# Altium project CM5_RP2040_MZM.PrjPcb (part 3 of 3)

## Sheet Bias_Q.SchDoc: 11 - Canal de BIAS Q
size A3; Project: CM5 Photonic Bias Controller; DocumentRev: R5; ProjectRev: R5; Version: Rev R6; SheetNumber: 12; SheetTotal: 17; Author: Carlos Renan; SCH_SCALE: N/A; Address1: UFCG; Address2: Referencia: VIRTUS CC; Address3: Campina Grande - PB; ProjectName: Controle automatico de BIAS para MZM/IQ - Projeto 3; DocumentName: Bias_Q.SchDoc
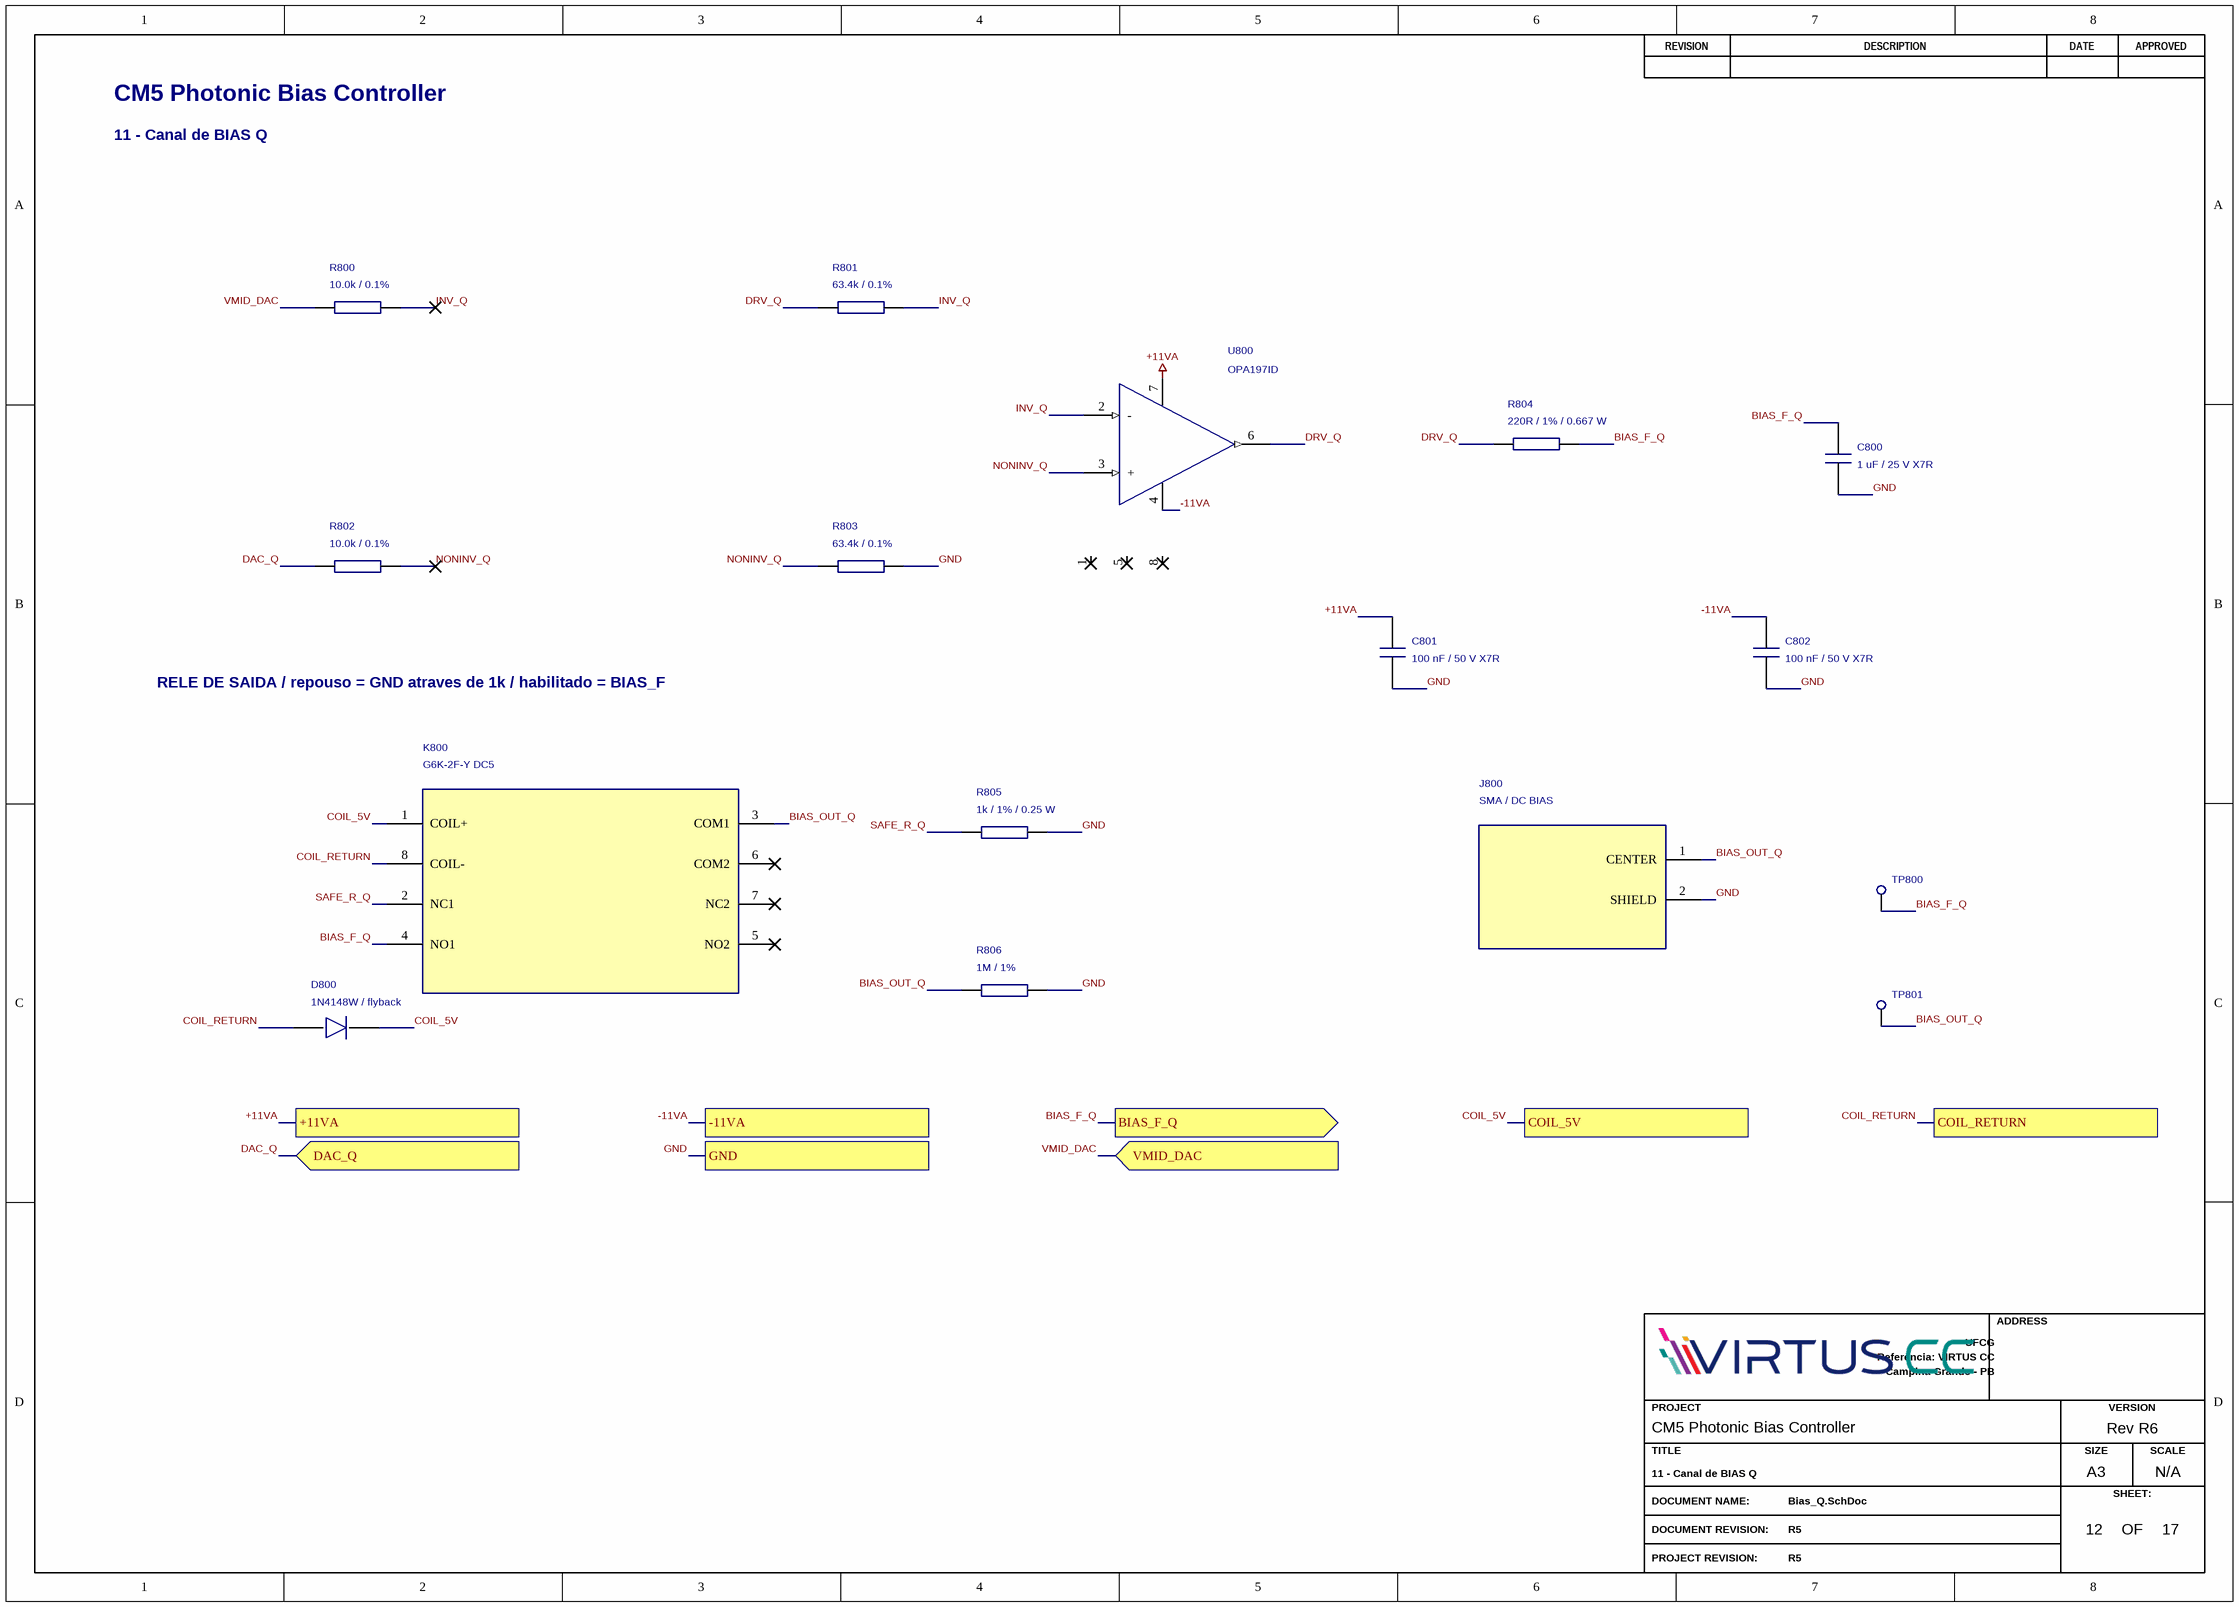
[diagram p14: Bias_Q.SchDoc]

### Parts
C800  1 uF / 25 V X7R  [C0805]
C801  100 nF / 50 V X7R  [C0805]
C802  100 nF / 50 V X7R  [C0805]
D800  1N4148W / flyback  [SOD-123]
J800  SMA / DC BIAS  [SMA_132134]
K800  G6K-2F-Y DC5  [G6K_2F_Y]
R800  10.0k / 0.1%  [R-0603]
R801  63.4k / 0.1%  [R-0603]
R802  10.0k / 0.1%  [R-0603]
R803  63.4k / 0.1%  [R-0603]
R804  220R / 1% / 0.667 W  [R1206]
R805  1k / 1% / 0.25 W  [R1206]
R806  1M / 1%  [R-0603]
TP800  Testpoint  [TP06R]  (value not drawn)
TP801  Testpoint  [TP06R]  (value not drawn)
U800  OPA197ID  [SOIC8]

### Ports
+11VA, -11VA, BIAS_F_Q (out), COIL_5V, COIL_RETURN, DAC_Q (in), GND, VMID_DAC (in)

### Nets
+11VA: C801.1 U800.7(V+) ; port +11VA
GND: C800.2 C801.2 C802.2 J800.2(SHIELD) R803.2 R805.2 R806.2 ; port GND
-11VA: C802.1 U800.4(V-) ; port -11VA
BIAS_F_Q: C800.1 K800.4(NO1) R804.2 TP800.1(TP) ; port BIAS_F_Q
BIAS_OUT_Q: J800.1(CENTER) K800.3(COM1) R806.1 TP801.1(TP)
COIL_5V: D800.1(K) K800.1(COIL+) ; port COIL_5V
COIL_RETURN: D800.2(A) K800.8(COIL-) ; port COIL_RETURN
DAC_Q: R802.1 ; port DAC_Q
DRV_Q: R801.1 R804.1 U800.6(OUT)
INV_Q: R800.2 R801.2 U800.2(-)
NONINV_Q: R802.2 R803.1 U800.3(+)
SAFE_R_Q: K800.2(NC1) R805.1
VMID_DAC: R800.1 ; port VMID_DAC

Not connected (* = marked no-connect by the designer): K800 5(NO2)* 6(COM2)* 7(NC2)*; U800 1(NC)* 5(NC)* 8(NC)*

### Notes on the sheet
- CM5 Photonic Bias Controller
- 11 - Canal de BIAS Q
- RELE DE SAIDA / repouso = GND atraves de 1k / habilitado = BIAS_F
- REVISION
- DESCRIPTION
- DATE
- APPROVED
- ADDRESS
- PROJECT
- VERSION
- TITLE
- A3
- SIZE
- SCALE
- DOCUMENT NAME:
- DOCUMENT REVISION:
- OF
- SHEET:
- PROJECT REVISION:

### Library data of the parts
C800 = 1 uF: Manufacturer: KEMET; Manufacturer Part Number: C0805C105K3RACTU; Procurement Status: Busca por MPN; SKU e disponibilidade a confirmar; BOM Purchase: Yes; Manufacturer 1: KEMET; Manufacturer Part Number 1: C0805C105K3RACTU; Supplier 1: DigiKey; Supplier URL 1: https://www.digikey.com.br/pt/products/result?keywords=C0805C105K3RACTU; Supplier 2: Mouser; Supplier URL 2: https://br.mouser.com/c/?q=C0805C105K3RACTU; Datasheet: https://www.yageogroup.com/download/specsheet/C0805C105K3RACTU
C801 C802 = 100 nF: Manufacturer: KEMET; Manufacturer Part Number: C0805C104K5RACTU; Procurement Status: Busca por MPN; SKU e disponibilidade a confirmar; BOM Purchase: Yes; Manufacturer 1: KEMET; Manufacturer Part Number 1: C0805C104K5RACTU; Supplier 1: DigiKey; Supplier URL 1: https://www.digikey.com.br/pt/products/result?keywords=C0805C104K5RACTU; Supplier 2: Mouser; Supplier URL 2: https://br.mouser.com/c/?q=C0805C104K5RACTU; Datasheet: https://www.yageogroup.com/download/specsheet/C0805C104K5RACTU
D800 = 1N4148W: Manufacturer: Diodes Incorporated; Manufacturer Part Number: 1N4148W-7-F; Procurement Status: Busca por MPN; SKU e disponibilidade a confirmar; BOM Purchase: Yes; Manufacturer 1: Diodes Incorporated; Manufacturer Part Number 1: 1N4148W-7-F; Supplier 1: DigiKey; Supplier URL 1: https://www.digikey.com.br/pt/products/result?keywords=1N4148W-7-F; Supplier 2: Mouser; Supplier URL 2: https://br.mouser.com/c/?q=1N4148W-7-F; Datasheet: https://www.diodes.com/datasheet/download/1N4148W.pdf
J800 = SMA: Manufacturer: Amphenol RF; Manufacturer Part Number: 132134; Procurement Status: Busca por MPN; SKU e disponibilidade a confirmar; BOM Purchase: Yes; Manufacturer 1: Amphenol RF; Manufacturer Part Number 1: 132134; Supplier 1: DigiKey; Supplier URL 1: https://www.digikey.com.br/pt/products/result?keywords=132134; Supplier 2: Mouser; Supplier URL 2: https://br.mouser.com/c/?q=132134; Datasheet: https://www.amphenolrf.com/132134.html
K800 = G6K-2F-Y DC5: Manufacturer: Omron; Review: Bobina 1 positivo e 8 negativo; contato NC1=2, COM1=3, NO1=4.; Procurement Status: Busca por MPN; SKU e disponibilidade a confirmar; BOM Purchase: Yes; Manufacturer Part Number: G6K-2F-Y DC5; Manufacturer 1: Omron; Manufacturer Part Number 1: G6K-2F-Y DC5; Supplier 1: DigiKey; Supplier URL 1: https://www.digikey.com.br/pt/products/result?keywords=G6K-2F-Y%20DC5; Supplier 2: Mouser; Supplier URL 2: https://br.mouser.com/c/?q=G6K-2F-Y%20DC5; Datasheet: https://components.omron.com/us-en/datasheet_pdf/J156-E1.pdf
R800 R802 = 10.0k: Manufacturer: YAGEO; Manufacturer Part Number: RT0603BRD0710KL; Review: Filme fino, 0,1%, 25 ppm/K; 0,1 W. Verificar dissipacao em R210/R212 e matching dos drivers.; Procurement Status: Busca por MPN; SKU e disponibilidade a confirmar; BOM Purchase: Yes; Manufacturer 1: YAGEO; Manufacturer Part Number 1: RT0603BRD0710KL; Supplier 1: DigiKey; Supplier URL 1: https://www.digikey.com.br/pt/products/result?keywords=RT0603BRD0710KL; Supplier 2: Mouser; Supplier URL 2: https://br.mouser.com/c/?q=RT0603BRD0710KL; Datasheet: https://www.yageo.com/en/Product/Index/rchip
R801 R803 = 63.4k: Manufacturer: YAGEO; Manufacturer Part Number: RT0603BRD0763K4L; Review: Filme fino, 0,1%, 25 ppm/K; 0,1 W. Verificar dissipacao em R210/R212 e matching dos drivers.; Procurement Status: Busca por MPN; SKU e disponibilidade a confirmar; BOM Purchase: Yes; Manufacturer 1: YAGEO; Manufacturer Part Number 1: RT0603BRD0763K4L; Supplier 1: DigiKey; Supplier URL 1: https://www.digikey.com.br/pt/products/result?keywords=RT0603BRD0763K4L; Supplier 2: Mouser; Supplier URL 2: https://br.mouser.com/c/?q=RT0603BRD0763K4L; Datasheet: https://www.yageo.com/en/Product/Index/rchip
R804 = 220R: Manufacturer: Panasonic Industry; Manufacturer Part Number: ERJ-P08F2200V; Procurement Status: SKU conferido; consultar disponibilidade; BOM Purchase: Yes; Manufacturer 1: Panasonic Industry; Manufacturer Part Number 1: ERJ-P08F2200V; Supplier 1: DigiKey; Supplier Part Number 1: 10-ERJ-P08F2200VCT-ND; Supplier URL 1: https://www.digikey.com/en/products/detail/panasonic-industry/ERJ-P08F2200V/9812789; Supplier 2: Mouser; Supplier URL 2: https://br.mouser.com/c/?q=ERJ-P08F2200V; Datasheet: https://industrial.panasonic.com/cdbs/www-data/pdf/RDA0000/AOA0000C304.pdf
R805 = 1.00k: Manufacturer: YAGEO; Manufacturer Part Number: RC1206FR-071KL; Procurement Status: Busca por MPN; SKU e disponibilidade a confirmar; BOM Purchase: Yes; Manufacturer 1: YAGEO; Manufacturer Part Number 1: RC1206FR-071KL; Supplier 1: DigiKey; Supplier URL 1: https://www.digikey.com.br/pt/products/result?keywords=RC1206FR-071KL; Supplier 2: Mouser; Supplier URL 2: https://br.mouser.com/c/?q=RC1206FR-071KL; Datasheet: https://www.yageo.com/en/Product/Index/rchip
R806 = 1M: Manufacturer: YAGEO; Manufacturer Part Number: RC0603FR-071ML; Procurement Status: Busca por MPN; SKU e disponibilidade a confirmar; BOM Purchase: Yes; Manufacturer 1: YAGEO; Manufacturer Part Number 1: RC0603FR-071ML; Supplier 1: DigiKey; Supplier URL 1: https://www.digikey.com.br/pt/products/result?keywords=RC0603FR-071ML; Supplier 2: Mouser; Supplier URL 2: https://br.mouser.com/c/?q=RC0603FR-071ML; Datasheet: https://www.yageo.com/en/Product/Index/rchip
TP800 TP801 = Testpoint: Review: Testpoint em cobre; excluido da BOM de compra.; Procurement Status: Recurso de cobre da PCB; nao comprar; BOM Purchase: No - PCB feature
U800 = OPA197ID: Manufacturer: Texas Instruments; Procurement Status: Busca por MPN; SKU e disponibilidade a confirmar; BOM Purchase: Yes; Manufacturer Part Number: OPA197ID; Manufacturer 1: Texas Instruments; Manufacturer Part Number 1: OPA197ID; Supplier 1: DigiKey; Supplier URL 1: https://www.digikey.com.br/pt/products/result?keywords=OPA197ID; Supplier 2: Mouser; Supplier URL 2: https://br.mouser.com/c/?q=OPA197ID; Datasheet: https://www.ti.com/lit/ds/symlink/opa197.pdf

## Sheet Bias_PHI.SchDoc: 12 - Canal de BIAS de fase
size A3; Project: CM5 Photonic Bias Controller; DocumentRev: R5; ProjectRev: R5; Version: Rev R6; SheetNumber: 13; SheetTotal: 17; Author: Carlos Renan; SCH_SCALE: N/A; Address1: UFCG; Address2: Referencia: VIRTUS CC; Address3: Campina Grande - PB; ProjectName: Controle automatico de BIAS para MZM/IQ - Projeto 3; DocumentName: Bias_PHI.SchDoc
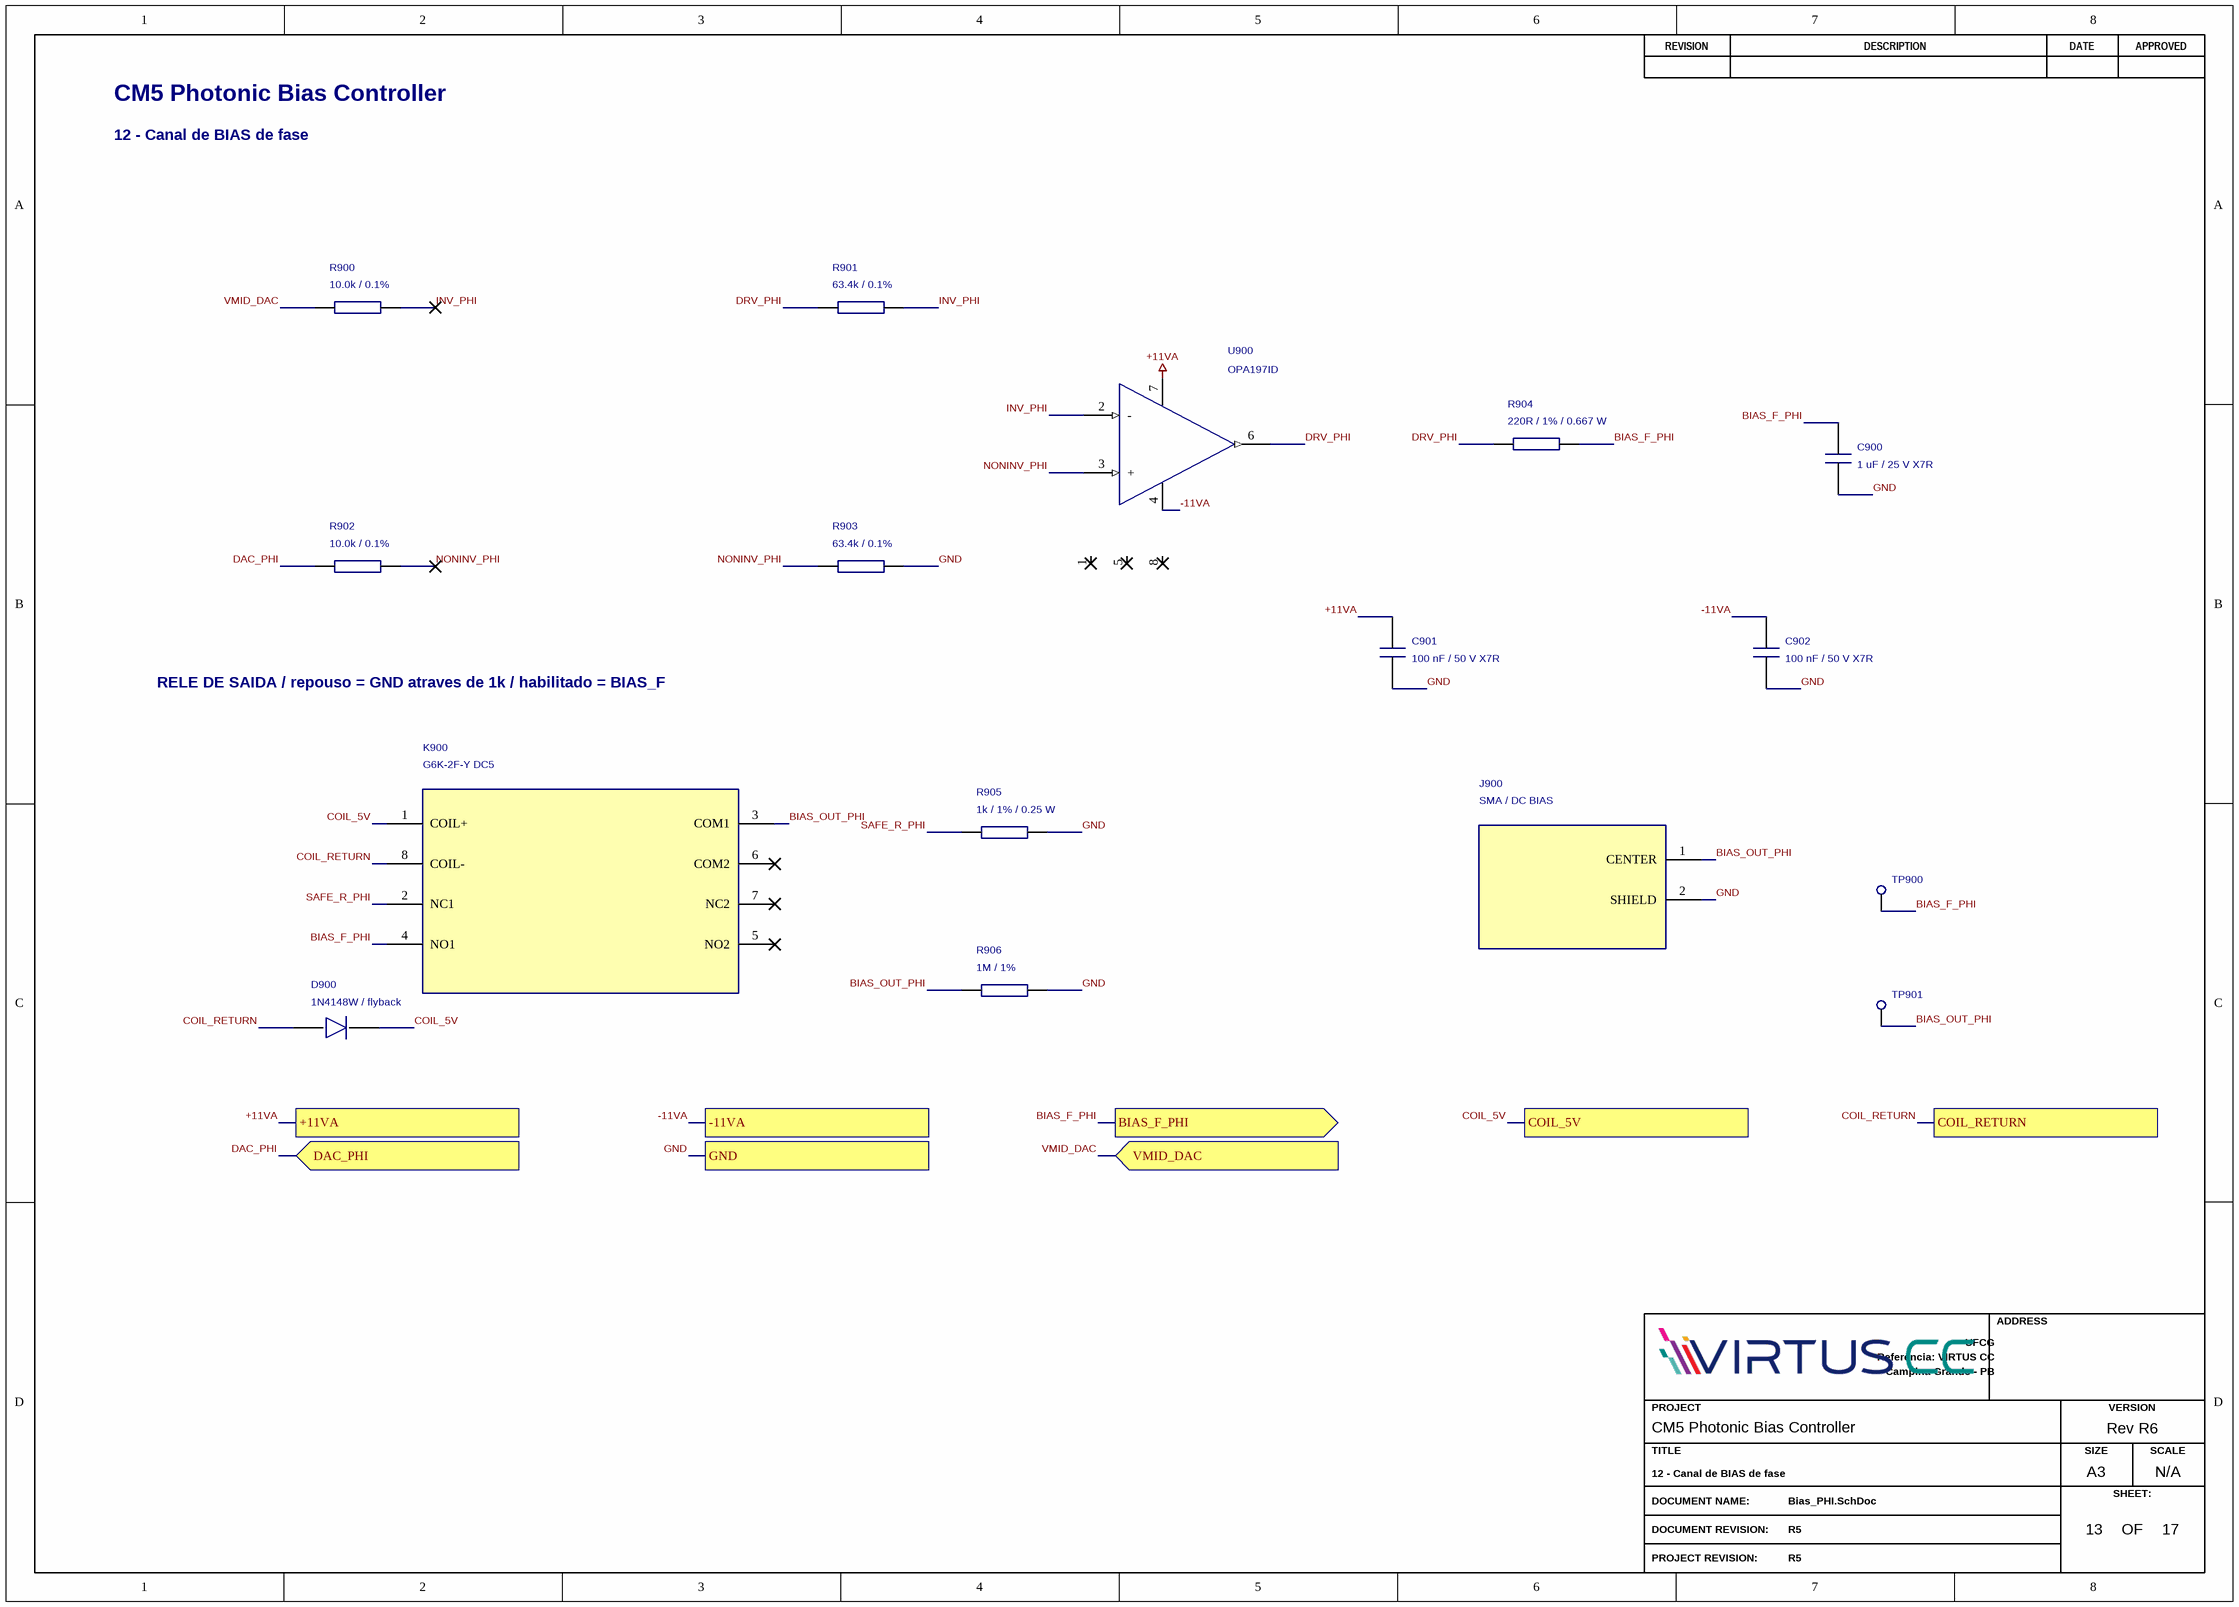
[diagram p15: Bias_PHI.SchDoc]

### Parts
C900  1 uF / 25 V X7R  [C0805]
C901  100 nF / 50 V X7R  [C0805]
C902  100 nF / 50 V X7R  [C0805]
D900  1N4148W / flyback  [SOD-123]
J900  SMA / DC BIAS  [SMA_132134]
K900  G6K-2F-Y DC5  [G6K_2F_Y]
R900  10.0k / 0.1%  [R-0603]
R901  63.4k / 0.1%  [R-0603]
R902  10.0k / 0.1%  [R-0603]
R903  63.4k / 0.1%  [R-0603]
R904  220R / 1% / 0.667 W  [R1206]
R905  1k / 1% / 0.25 W  [R1206]
R906  1M / 1%  [R-0603]
TP900  Testpoint  [TP06R]  (value not drawn)
TP901  Testpoint  [TP06R]  (value not drawn)
U900  OPA197ID  [SOIC8]

### Ports
+11VA, -11VA, BIAS_F_PHI (out), COIL_5V, COIL_RETURN, DAC_PHI (in), GND, VMID_DAC (in)

### Nets
+11VA: C901.1 U900.7(V+) ; port +11VA
GND: C900.2 C901.2 C902.2 J900.2(SHIELD) R903.2 R905.2 R906.2 ; port GND
-11VA: C902.1 U900.4(V-) ; port -11VA
BIAS_F_PHI: C900.1 K900.4(NO1) R904.2 TP900.1(TP) ; port BIAS_F_PHI
BIAS_OUT_PHI: J900.1(CENTER) K900.3(COM1) R906.1 TP901.1(TP)
COIL_5V: D900.1(K) K900.1(COIL+) ; port COIL_5V
COIL_RETURN: D900.2(A) K900.8(COIL-) ; port COIL_RETURN
DAC_PHI: R902.1 ; port DAC_PHI
DRV_PHI: R901.1 R904.1 U900.6(OUT)
INV_PHI: R900.2 R901.2 U900.2(-)
NONINV_PHI: R902.2 R903.1 U900.3(+)
SAFE_R_PHI: K900.2(NC1) R905.1
VMID_DAC: R900.1 ; port VMID_DAC

Not connected (* = marked no-connect by the designer): K900 5(NO2)* 6(COM2)* 7(NC2)*; U900 1(NC)* 5(NC)* 8(NC)*

### Notes on the sheet
- CM5 Photonic Bias Controller
- 12 - Canal de BIAS de fase
- RELE DE SAIDA / repouso = GND atraves de 1k / habilitado = BIAS_F
- REVISION
- DESCRIPTION
- DATE
- APPROVED
- ADDRESS
- PROJECT
- VERSION
- TITLE
- A3
- SIZE
- SCALE
- DOCUMENT NAME:
- DOCUMENT REVISION:
- OF
- SHEET:
- PROJECT REVISION:

### Library data of the parts
C900 = 1 uF: as C800 on sheet Bias_Q; Manufacturer 1: KEMET; Manufacturer Part Number 1: C0805C105K3RACTU; Supplier 1: DigiKey; Supplier URL 1: https://www.digikey.com.br/pt/products/result?keywords=C0805C105K3RACTU; Supplier 2: Mouser; Supplier URL 2: https://br.mouser.com/c/?q=C0805C105K3RACTU; Datasheet: https://www.yageogroup.com/download/specsheet/C0805C105K3RACTU
C901 C902 = 100 nF: as C801 on sheet Bias_Q; Manufacturer 1: KEMET; Manufacturer Part Number 1: C0805C104K5RACTU; Supplier 1: DigiKey; Supplier URL 1: https://www.digikey.com.br/pt/products/result?keywords=C0805C104K5RACTU; Supplier 2: Mouser; Supplier URL 2: https://br.mouser.com/c/?q=C0805C104K5RACTU; Datasheet: https://www.yageogroup.com/download/specsheet/C0805C104K5RACTU
D900 = 1N4148W: as D800 on sheet Bias_Q; Manufacturer 1: Diodes Incorporated; Manufacturer Part Number 1: 1N4148W-7-F; Supplier 1: DigiKey; Supplier URL 1: https://www.digikey.com.br/pt/products/result?keywords=1N4148W-7-F; Supplier 2: Mouser; Supplier URL 2: https://br.mouser.com/c/?q=1N4148W-7-F; Datasheet: https://www.diodes.com/datasheet/download/1N4148W.pdf
J900 = SMA: as J800 on sheet Bias_Q; Manufacturer 1: Amphenol RF; Manufacturer Part Number 1: 132134; Supplier 1: DigiKey; Supplier URL 1: https://www.digikey.com.br/pt/products/result?keywords=132134; Supplier 2: Mouser; Supplier URL 2: https://br.mouser.com/c/?q=132134; Datasheet: https://www.amphenolrf.com/132134.html
K900 = G6K-2F-Y DC5: as K800 on sheet Bias_Q; Manufacturer Part Number: G6K-2F-Y DC5; Manufacturer 1: Omron; Manufacturer Part Number 1: G6K-2F-Y DC5; Supplier 1: DigiKey; Supplier URL 1: https://www.digikey.com.br/pt/products/result?keywords=G6K-2F-Y%20DC5; Supplier 2: Mouser; Supplier URL 2: https://br.mouser.com/c/?q=G6K-2F-Y%20DC5; Datasheet: https://components.omron.com/us-en/datasheet_pdf/J156-E1.pdf
R900 R902 = 10.0k: as R800 on sheet Bias_Q; Manufacturer 1: YAGEO; Manufacturer Part Number 1: RT0603BRD0710KL; Supplier 1: DigiKey; Supplier URL 1: https://www.digikey.com.br/pt/products/result?keywords=RT0603BRD0710KL; Supplier 2: Mouser; Supplier URL 2: https://br.mouser.com/c/?q=RT0603BRD0710KL; Datasheet: https://www.yageo.com/en/Product/Index/rchip
R901 R903 = 63.4k: as R801 on sheet Bias_Q; Manufacturer 1: YAGEO; Manufacturer Part Number 1: RT0603BRD0763K4L; Supplier 1: DigiKey; Supplier URL 1: https://www.digikey.com.br/pt/products/result?keywords=RT0603BRD0763K4L; Supplier 2: Mouser; Supplier URL 2: https://br.mouser.com/c/?q=RT0603BRD0763K4L; Datasheet: https://www.yageo.com/en/Product/Index/rchip
R904 = 220R: as R804 on sheet Bias_Q; Manufacturer 1: Panasonic Industry; Manufacturer Part Number 1: ERJ-P08F2200V; Supplier 1: DigiKey; Supplier Part Number 1: 10-ERJ-P08F2200VCT-ND; Supplier URL 1: https://www.digikey.com/en/products/detail/panasonic-industry/ERJ-P08F2200V/9812789; Supplier 2: Mouser; Supplier URL 2: https://br.mouser.com/c/?q=ERJ-P08F2200V; Datasheet: https://industrial.panasonic.com/cdbs/www-data/pdf/RDA0000/AOA0000C304.pdf
R905 = 1.00k: as R805 on sheet Bias_Q; Manufacturer 1: YAGEO; Manufacturer Part Number 1: RC1206FR-071KL; Supplier 1: DigiKey; Supplier URL 1: https://www.digikey.com.br/pt/products/result?keywords=RC1206FR-071KL; Supplier 2: Mouser; Supplier URL 2: https://br.mouser.com/c/?q=RC1206FR-071KL; Datasheet: https://www.yageo.com/en/Product/Index/rchip
R906 = 1M: as R806 on sheet Bias_Q; Manufacturer 1: YAGEO; Manufacturer Part Number 1: RC0603FR-071ML; Supplier 1: DigiKey; Supplier URL 1: https://www.digikey.com.br/pt/products/result?keywords=RC0603FR-071ML; Supplier 2: Mouser; Supplier URL 2: https://br.mouser.com/c/?q=RC0603FR-071ML; Datasheet: https://www.yageo.com/en/Product/Index/rchip
TP900 TP901 = Testpoint: as TP800 on sheet Bias_Q
U900 = OPA197ID: as U800 on sheet Bias_Q; Manufacturer Part Number: OPA197ID; Manufacturer 1: Texas Instruments; Manufacturer Part Number 1: OPA197ID; Supplier 1: DigiKey; Supplier URL 1: https://www.digikey.com.br/pt/products/result?keywords=OPA197ID; Supplier 2: Mouser; Supplier URL 2: https://br.mouser.com/c/?q=OPA197ID; Datasheet: https://www.ti.com/lit/ds/symlink/opa197.pdf

## Sheet Safety_Window.SchDoc: 13 - Janela de tensao e supervisao de rails
size A3; Project: CM5 Photonic Bias Controller; DocumentRev: R5; ProjectRev: R5; Version: Rev R6; SheetNumber: 14; SheetTotal: 17; Author: Carlos Renan; SCH_SCALE: N/A; Address1: UFCG; Address2: Referencia: VIRTUS CC; Address3: Campina Grande - PB; ProjectName: Controle automatico de BIAS para MZM/IQ - Projeto 3; DocumentName: Safety_Window.SchDoc
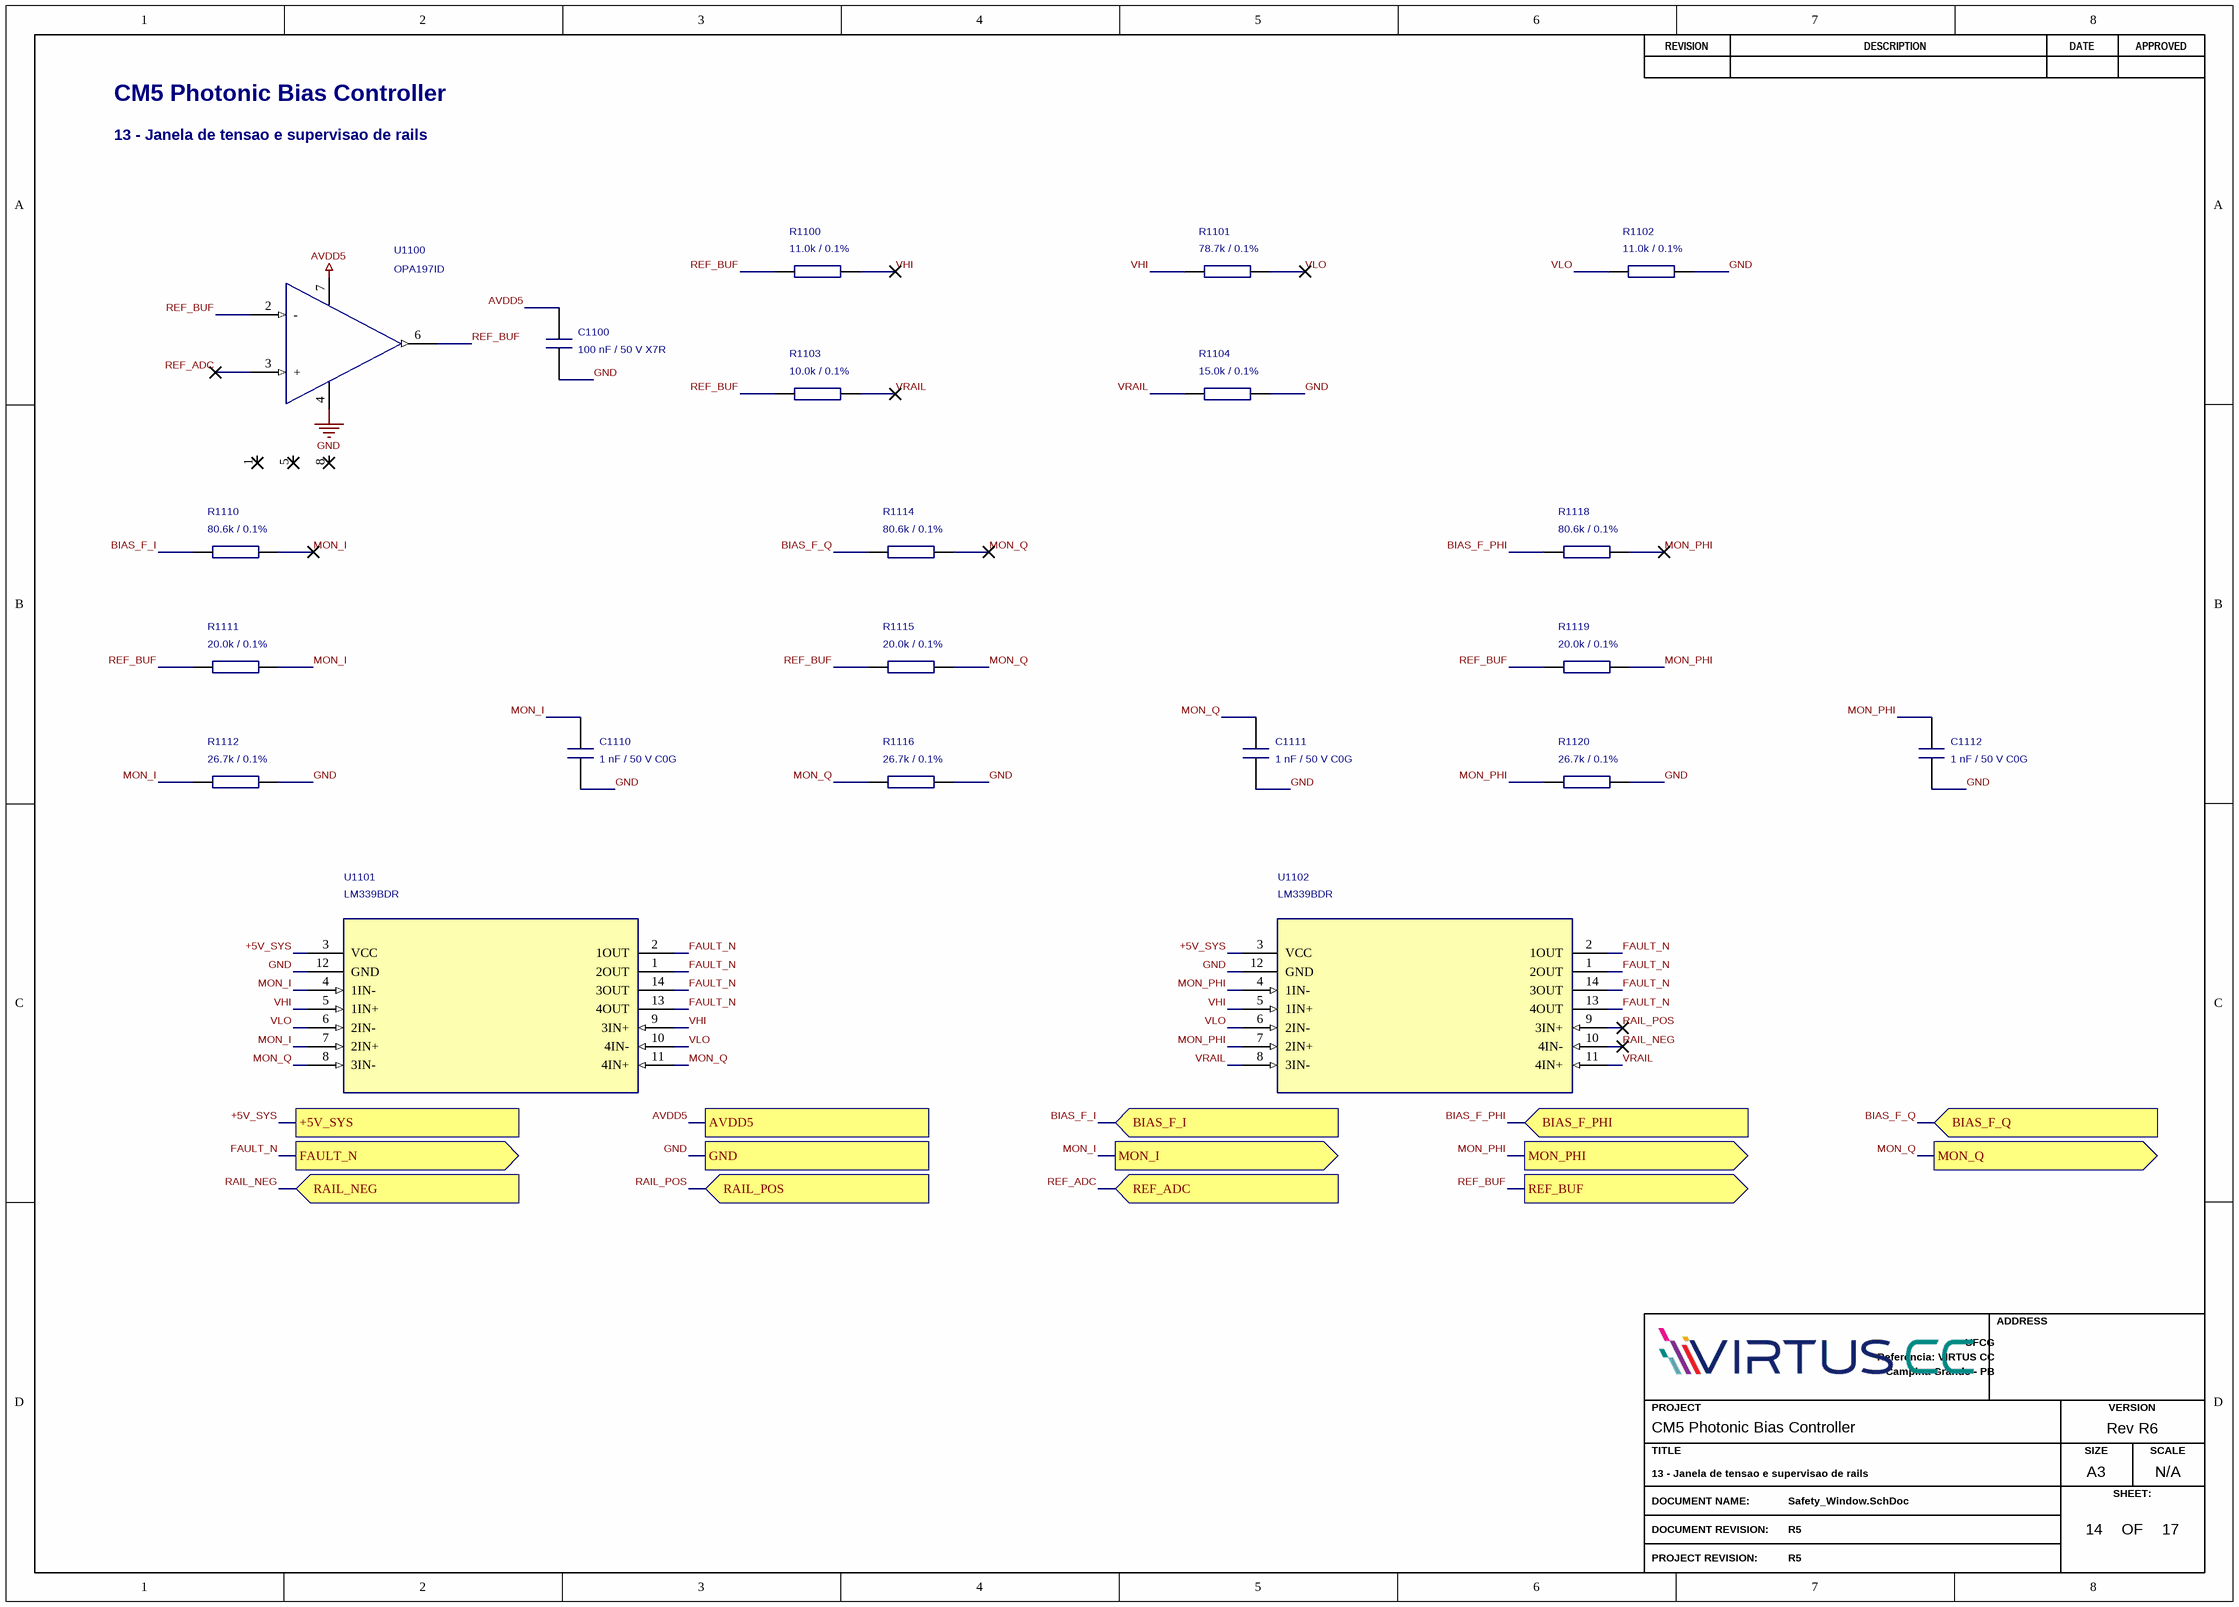
[diagram p16: Safety_Window.SchDoc]

### Parts
C1100  100 nF / 50 V X7R  [C0805]
C1110  1 nF / 50 V C0G  [C0805]
C1111  1 nF / 50 V C0G  [C0805]
C1112  1 nF / 50 V C0G  [C0805]
R1100  11.0k / 0.1%  [R-0603]
R1101  78.7k / 0.1%  [R-0603]
R1102  11.0k / 0.1%  [R-0603]
R1103  10.0k / 0.1%  [R-0603]
R1104  15.0k / 0.1%  [R-0603]
R1110  80.6k / 0.1%  [R-0603]
R1111  20.0k / 0.1%  [R-0603]
R1112  26.7k / 0.1%  [R-0603]
R1114  80.6k / 0.1%  [R-0603]
R1115  20.0k / 0.1%  [R-0603]
R1116  26.7k / 0.1%  [R-0603]
R1118  80.6k / 0.1%  [R-0603]
R1119  20.0k / 0.1%  [R-0603]
R1120  26.7k / 0.1%  [R-0603]
U1100  OPA197ID  [SOIC8]
U1101  LM339BDR  [SOIC14]
U1102  LM339BDR  [SOIC14]

### Ports
+5V_SYS, AVDD5, BIAS_F_I (in), BIAS_F_PHI (in), BIAS_F_Q (in), FAULT_N (out), GND, MON_I (out), MON_PHI (out), MON_Q (out), RAIL_NEG (in), RAIL_POS (in), REF_ADC (in), REF_BUF (out)

### Nets
AVDD5: C1100.1 U1100.7(V+) ; port AVDD5
GND: C1100.2 C1110.2 C1111.2 C1112.2 R1102.2 R1104.2 R1112.2 R1116.2 R1120.2 U1100.4(V-) U1101.12(GND) U1102.12(GND) ; port GND
+5V_SYS: U1101.3(VCC) U1102.3(VCC) ; port +5V_SYS
BIAS_F_I: R1110.1 ; port BIAS_F_I
BIAS_F_PHI: R1118.1 ; port BIAS_F_PHI
BIAS_F_Q: R1114.1 ; port BIAS_F_Q
FAULT_N: U1101.1(2OUT) U1101.2(1OUT) U1101.13(4OUT) U1101.14(3OUT) U1102.1(2OUT) U1102.2(1OUT) U1102.13(4OUT) U1102.14(3OUT) ; port FAULT_N
MON_I: C1110.1 R1110.2 R1111.2 R1112.1 U1101.4(1IN-) U1101.7(2IN+) ; port MON_I
MON_PHI: C1112.1 R1118.2 R1119.2 R1120.1 U1102.4(1IN-) U1102.7(2IN+) ; port MON_PHI
MON_Q: C1111.1 R1114.2 R1115.2 R1116.1 U1101.8(3IN-) U1101.11(4IN+) ; port MON_Q
RAIL_NEG: U1102.10(4IN-) ; port RAIL_NEG
RAIL_POS: U1102.9(3IN+) ; port RAIL_POS
REF_ADC: U1100.3(+) ; port REF_ADC
REF_BUF: R1100.1 R1103.1 R1111.1 R1115.1 R1119.1 U1100.2(-) U1100.6(OUT) ; port REF_BUF
VHI: R1100.2 R1101.1 U1101.5(1IN+) U1101.9(3IN+) U1102.5(1IN+)
VLO: R1101.2 R1102.1 U1101.6(2IN-) U1101.10(4IN-) U1102.6(2IN-)
VRAIL: R1103.2 R1104.1 U1102.8(3IN-) U1102.11(4IN+)

Not connected (* = marked no-connect by the designer): U1100 1(NC)* 5(NC)* 8(NC)*

### Notes on the sheet
- CM5 Photonic Bias Controller
- 13 - Janela de tensao e supervisao de rails
- REVISION
- DESCRIPTION
- DATE
- APPROVED
- ADDRESS
- PROJECT
- VERSION
- TITLE
- A3
- SIZE
- SCALE
- DOCUMENT NAME:
- DOCUMENT REVISION:
- OF
- SHEET:
- PROJECT REVISION:

### Library data of the parts
C1100 = 100 nF: as C801 on sheet Bias_Q; Manufacturer 1: KEMET; Manufacturer Part Number 1: C0805C104K5RACTU; Supplier 1: DigiKey; Supplier URL 1: https://www.digikey.com.br/pt/products/result?keywords=C0805C104K5RACTU; Supplier 2: Mouser; Supplier URL 2: https://br.mouser.com/c/?q=C0805C104K5RACTU; Datasheet: https://www.yageogroup.com/download/specsheet/C0805C104K5RACTU
C1110-C1112 = 1 nF: Manufacturer: KEMET; Manufacturer Part Number: C0805C102J5GACTU; Procurement Status: Busca por MPN; SKU e disponibilidade a confirmar; BOM Purchase: Yes; Manufacturer 1: KEMET; Manufacturer Part Number 1: C0805C102J5GACTU; Supplier 1: DigiKey; Supplier URL 1: https://www.digikey.com.br/pt/products/result?keywords=C0805C102J5GACTU; Supplier 2: Mouser; Supplier URL 2: https://br.mouser.com/c/?q=C0805C102J5GACTU; Datasheet: https://www.yageogroup.com/download/specsheet/C0805C102J5GACTU
R1100 R1102 = 11.0k: Manufacturer: YAGEO; Manufacturer Part Number: RT0603BRD0711KL; Review: Filme fino, 0,1%, 25 ppm/K; 0,1 W. Verificar dissipacao em R210/R212 e matching dos drivers.; Procurement Status: Busca por MPN; SKU e disponibilidade a confirmar; BOM Purchase: Yes; Manufacturer 1: YAGEO; Manufacturer Part Number 1: RT0603BRD0711KL; Supplier 1: DigiKey; Supplier URL 1: https://www.digikey.com.br/pt/products/result?keywords=RT0603BRD0711KL; Supplier 2: Mouser; Supplier URL 2: https://br.mouser.com/c/?q=RT0603BRD0711KL; Datasheet: https://www.yageo.com/en/Product/Index/rchip
R1101 = 78.7k: Manufacturer: YAGEO; Manufacturer Part Number: RT0603BRD0778K7L; Review: Filme fino, 0,1%, 25 ppm/K; 0,1 W. Verificar dissipacao em R210/R212 e matching dos drivers.; Procurement Status: Busca por MPN; SKU e disponibilidade a confirmar; BOM Purchase: Yes; Manufacturer 1: YAGEO; Manufacturer Part Number 1: RT0603BRD0778K7L; Supplier 1: DigiKey; Supplier URL 1: https://www.digikey.com.br/pt/products/result?keywords=RT0603BRD0778K7L; Supplier 2: Mouser; Supplier URL 2: https://br.mouser.com/c/?q=RT0603BRD0778K7L; Datasheet: https://www.yageo.com/en/Product/Index/rchip
R1103 = 10.0k: as R800 on sheet Bias_Q; Manufacturer 1: YAGEO; Manufacturer Part Number 1: RT0603BRD0710KL; Supplier 1: DigiKey; Supplier URL 1: https://www.digikey.com.br/pt/products/result?keywords=RT0603BRD0710KL; Supplier 2: Mouser; Supplier URL 2: https://br.mouser.com/c/?q=RT0603BRD0710KL; Datasheet: https://www.yageo.com/en/Product/Index/rchip
R1104 = 15.0k: Manufacturer: YAGEO; Manufacturer Part Number: RT0603BRD0715KL; Review: Filme fino, 0,1%, 25 ppm/K; 0,1 W. Verificar dissipacao em R210/R212 e matching dos drivers.; Procurement Status: Busca por MPN; SKU e disponibilidade a confirmar; BOM Purchase: Yes; Manufacturer 1: YAGEO; Manufacturer Part Number 1: RT0603BRD0715KL; Supplier 1: DigiKey; Supplier URL 1: https://www.digikey.com.br/pt/products/result?keywords=RT0603BRD0715KL; Supplier 2: Mouser; Supplier URL 2: https://br.mouser.com/c/?q=RT0603BRD0715KL; Datasheet: https://www.yageo.com/en/Product/Index/rchip
R1110 R1114 R1118 = 80.6k: Manufacturer: YAGEO; Manufacturer Part Number: RT0603BRD0780K6L; Review: Filme fino, 0,1%, 25 ppm/K; 0,1 W. Verificar dissipacao em R210/R212 e matching dos drivers.; Procurement Status: Busca por MPN; SKU e disponibilidade a confirmar; BOM Purchase: Yes; Manufacturer 1: YAGEO; Manufacturer Part Number 1: RT0603BRD0780K6L; Supplier 1: DigiKey; Supplier URL 1: https://www.digikey.com.br/pt/products/result?keywords=RT0603BRD0780K6L; Supplier 2: Mouser; Supplier URL 2: https://br.mouser.com/c/?q=RT0603BRD0780K6L; Datasheet: https://www.yageo.com/en/Product/Index/rchip
R1111 R1115 R1119 = 20.0k: Manufacturer: YAGEO; Manufacturer Part Number: RT0603BRD0720KL; Review: Filme fino, 0,1%, 25 ppm/K; 0,1 W. Verificar dissipacao em R210/R212 e matching dos drivers.; Procurement Status: Busca por MPN; SKU e disponibilidade a confirmar; BOM Purchase: Yes; Manufacturer 1: YAGEO; Manufacturer Part Number 1: RT0603BRD0720KL; Supplier 1: DigiKey; Supplier URL 1: https://www.digikey.com.br/pt/products/result?keywords=RT0603BRD0720KL; Supplier 2: Mouser; Supplier URL 2: https://br.mouser.com/c/?q=RT0603BRD0720KL; Datasheet: https://www.yageo.com/en/Product/Index/rchip
R1112 R1116 R1120 = 26.7k: Manufacturer: YAGEO; Manufacturer Part Number: RT0603BRD0726K7L; Review: Filme fino, 0,1%, 25 ppm/K; 0,1 W. Verificar dissipacao em R210/R212 e matching dos drivers.; Procurement Status: Busca por MPN; SKU e disponibilidade a confirmar; BOM Purchase: Yes; Manufacturer 1: YAGEO; Manufacturer Part Number 1: RT0603BRD0726K7L; Supplier 1: DigiKey; Supplier URL 1: https://www.digikey.com.br/pt/products/result?keywords=RT0603BRD0726K7L; Supplier 2: Mouser; Supplier URL 2: https://br.mouser.com/c/?q=RT0603BRD0726K7L; Datasheet: https://www.yageo.com/en/Product/Index/rchip
U1100 = OPA197ID: as U800 on sheet Bias_Q; Manufacturer Part Number: OPA197ID; Manufacturer 1: Texas Instruments; Manufacturer Part Number 1: OPA197ID; Supplier 1: DigiKey; Supplier URL 1: https://www.digikey.com.br/pt/products/result?keywords=OPA197ID; Supplier 2: Mouser; Supplier URL 2: https://br.mouser.com/c/?q=OPA197ID; Datasheet: https://www.ti.com/lit/ds/symlink/opa197.pdf
U1101 U1102 = LM339BDR: Manufacturer: Texas Instruments; Procurement Status: Busca por MPN; SKU e disponibilidade a confirmar; BOM Purchase: Yes; Manufacturer Part Number: LM339BDR; Manufacturer 1: Texas Instruments; Manufacturer Part Number 1: LM339BDR; Supplier 1: DigiKey; Supplier URL 1: https://www.digikey.com.br/pt/products/result?keywords=LM339BDR; Supplier 2: Mouser; Supplier URL 2: https://br.mouser.com/c/?q=LM339BDR; Datasheet: https://www.ti.com/lit/ds/symlink/lm339b.pdf

## Sheet Safety_Watchdog.SchDoc: 14 - Heartbeats, armamento e desligamento
size A3; Project: CM5 Photonic Bias Controller; DocumentRev: R5; ProjectRev: R5; Version: Rev R6; SheetNumber: 15; SheetTotal: 17; Author: Carlos Renan; SCH_SCALE: N/A; Address1: UFCG; Address2: Referencia: VIRTUS CC; Address3: Campina Grande - PB; ProjectName: Controle automatico de BIAS para MZM/IQ - Projeto 3; DocumentName: Safety_Watchdog.SchDoc
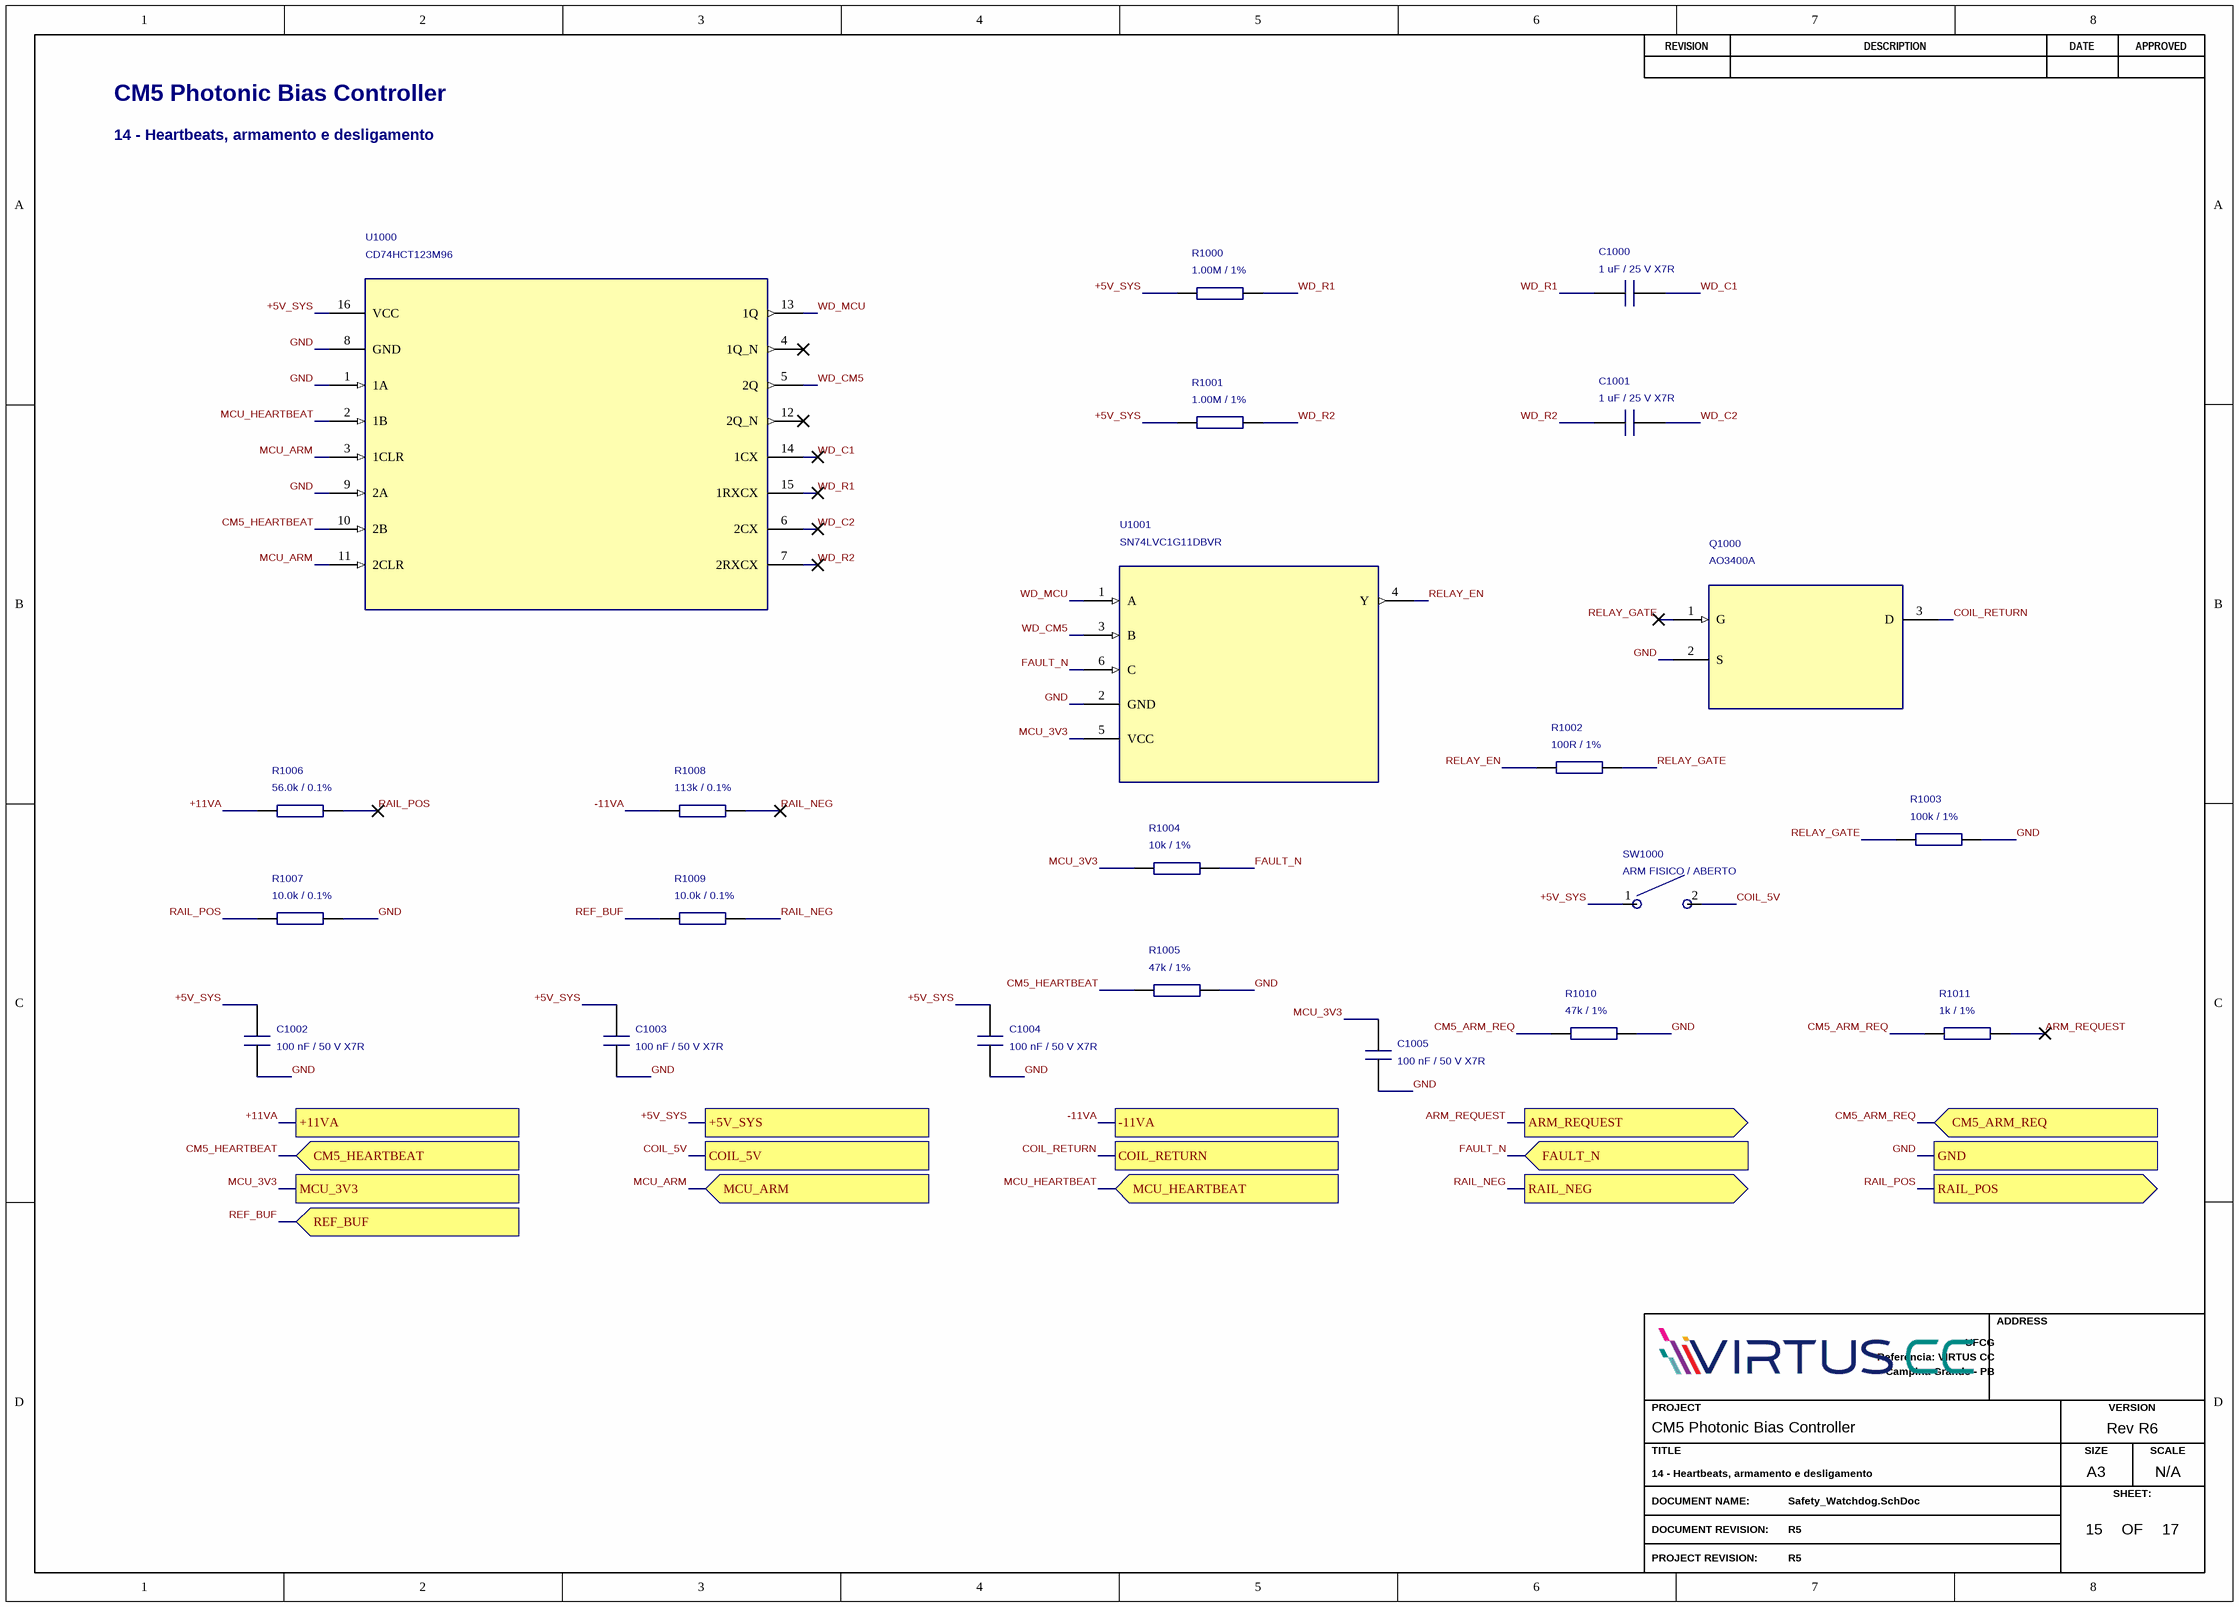
[diagram p17: Safety_Watchdog.SchDoc]

### Parts
C1000  1 uF / 25 V X7R  [C0805]
C1001  1 uF / 25 V X7R  [C0805]
C1002  100 nF / 50 V X7R  [C0805]
C1003  100 nF / 50 V X7R  [C0805]
C1004  100 nF / 50 V X7R  [C0805]
C1005  100 nF / 50 V X7R  [C0805]
Q1000  AO3400A  [ONSC-SOT-23-3-318-08_V]
R1000  1.00M / 1%  [R-0603]
R1001  1.00M / 1%  [R-0603]
R1002  100R / 1%  [R-0603]
R1003  100k / 1%  [R-0603]
R1004  10k / 1%  [R-0603]
R1005  47k / 1%  [R-0603]
R1006  56.0k / 0.1%  [R-0603]
R1007  10.0k / 0.1%  [R-0603]
R1008  113k / 0.1%  [R-0603]
R1009  10.0k / 0.1%  [R-0603]
R1010  47k / 1%  [R-0603]
R1011  1k / 1%  [R-0603]
SW1000  ARM FISICO / ABERTO  [HDR_1X02_P254]
U1000  CD74HCT123M96  [SOIC16]
U1001  SN74LVC1G11DBVR  [SOT26]

### Ports
+5V_SYS, +11VA, -11VA, ARM_REQUEST (out), CM5_ARM_REQ (in), CM5_HEARTBEAT (in), COIL_5V, COIL_RETURN, FAULT_N (in), GND, MCU_3V3, MCU_ARM (in), MCU_HEARTBEAT (in), RAIL_NEG (out), RAIL_POS (out), REF_BUF (in)

### Nets
+11VA: R1006.1 ; port +11VA
GND: C1002.2 C1003.2 C1004.2 C1005.2 Q1000.2(S) R1003.2 R1005.2 R1007.2 R1010.2 U1000.1(1A) U1000.8(GND) U1000.9(2A) U1001.2(GND) ; port GND
+5V_SYS: C1002.1 C1003.1 C1004.1 R1000.1 R1001.1 SW1000.1 U1000.16(VCC) ; port +5V_SYS
-11VA: R1008.1 ; port -11VA
ARM_REQUEST: R1011.2 ; port ARM_REQUEST
CM5_ARM_REQ: R1010.1 R1011.1 ; port CM5_ARM_REQ
CM5_HEARTBEAT: R1005.1 U1000.10(2B) ; port CM5_HEARTBEAT
COIL_5V: SW1000.2 ; port COIL_5V
COIL_RETURN: Q1000.3(D) ; port COIL_RETURN
FAULT_N: R1004.2 U1001.6(C) ; port FAULT_N
MCU_3V3: C1005.1 R1004.1 U1001.5(VCC) ; port MCU_3V3
MCU_ARM: U1000.3(1CLR) U1000.11(2CLR) ; port MCU_ARM
MCU_HEARTBEAT: U1000.2(1B) ; port MCU_HEARTBEAT
RAIL_NEG: R1008.2 R1009.2 ; port RAIL_NEG
RAIL_POS: R1006.2 R1007.1 ; port RAIL_POS
REF_BUF: R1009.1 ; port REF_BUF
RELAY_EN: R1002.1 U1001.4(Y)
RELAY_GATE: Q1000.1(G) R1002.2 R1003.1
WD_C1: C1000.2 U1000.14(1CX)
WD_C2: C1001.2 U1000.6(2CX)
WD_CM5: U1000.5(2Q) U1001.3(B)
WD_MCU: U1000.13(1Q) U1001.1(A)
WD_R1: C1000.1 R1000.2 U1000.15(1RXCX)
WD_R2: C1001.1 R1001.2 U1000.7(2RXCX)

Not connected (* = marked no-connect by the designer): U1000 4(1Q_N)* 12(2Q_N)*

### Notes on the sheet
- CM5 Photonic Bias Controller
- 14 - Heartbeats, armamento e desligamento
- REVISION
- DESCRIPTION
- DATE
- APPROVED
- ADDRESS
- PROJECT
- VERSION
- TITLE
- A3
- SIZE
- SCALE
- DOCUMENT NAME:
- DOCUMENT REVISION:
- OF
- SHEET:
- PROJECT REVISION:

### Library data of the parts
C1000 C1001 = 1 uF: as C800 on sheet Bias_Q; Manufacturer 1: KEMET; Manufacturer Part Number 1: C0805C105K3RACTU; Supplier 1: DigiKey; Supplier URL 1: https://www.digikey.com.br/pt/products/result?keywords=C0805C105K3RACTU; Supplier 2: Mouser; Supplier URL 2: https://br.mouser.com/c/?q=C0805C105K3RACTU; Datasheet: https://www.yageogroup.com/download/specsheet/C0805C105K3RACTU
C1002-C1005 = 100 nF: as C801 on sheet Bias_Q; Manufacturer 1: KEMET; Manufacturer Part Number 1: C0805C104K5RACTU; Supplier 1: DigiKey; Supplier URL 1: https://www.digikey.com.br/pt/products/result?keywords=C0805C104K5RACTU; Supplier 2: Mouser; Supplier URL 2: https://br.mouser.com/c/?q=C0805C104K5RACTU; Datasheet: https://www.yageogroup.com/download/specsheet/C0805C104K5RACTU
Q1000 = AO3400A: Manufacturer: Alpha & Omega Semiconductor; Procurement Status: Busca por MPN; SKU e disponibilidade a confirmar; BOM Purchase: Yes; Manufacturer Part Number: AO3400A; Manufacturer 1: Alpha & Omega Semiconductor; Manufacturer Part Number 1: AO3400A; Supplier 1: DigiKey; Supplier URL 1: https://www.digikey.com.br/pt/products/result?keywords=AO3400A; Supplier 2: Mouser; Supplier URL 2: https://br.mouser.com/c/?q=AO3400A; Datasheet: https://www.aosmd.com/sites/default/files/res/datasheets/AO3400A.pdf
R1000 R1001 = 1.00M: Manufacturer: YAGEO; Manufacturer Part Number: RC0603FR-071ML; Procurement Status: Busca por MPN; SKU e disponibilidade a confirmar; BOM Purchase: Yes; Manufacturer 1: YAGEO; Manufacturer Part Number 1: RC0603FR-071ML; Supplier 1: DigiKey; Supplier URL 1: https://www.digikey.com.br/pt/products/result?keywords=RC0603FR-071ML; Supplier 2: Mouser; Supplier URL 2: https://br.mouser.com/c/?q=RC0603FR-071ML; Datasheet: https://www.yageo.com/en/Product/Index/rchip
R1002 = 100R: Manufacturer: YAGEO; Manufacturer Part Number: RC0603FR-07100RL; Procurement Status: Busca por MPN; SKU e disponibilidade a confirmar; BOM Purchase: Yes; Manufacturer 1: YAGEO; Manufacturer Part Number 1: RC0603FR-07100RL; Supplier 1: DigiKey; Supplier URL 1: https://www.digikey.com.br/pt/products/result?keywords=RC0603FR-07100RL; Supplier 2: Mouser; Supplier URL 2: https://br.mouser.com/c/?q=RC0603FR-07100RL; Datasheet: https://www.yageo.com/en/Product/Index/rchip
R1003 = 100k: Manufacturer: YAGEO; Manufacturer Part Number: RC0603FR-07100KL; Procurement Status: Busca por MPN; SKU e disponibilidade a confirmar; BOM Purchase: Yes; Manufacturer 1: YAGEO; Manufacturer Part Number 1: RC0603FR-07100KL; Supplier 1: DigiKey; Supplier URL 1: https://www.digikey.com.br/pt/products/result?keywords=RC0603FR-07100KL; Supplier 2: Mouser; Supplier URL 2: https://br.mouser.com/c/?q=RC0603FR-07100KL; Datasheet: https://www.yageo.com/en/Product/Index/rchip
R1004 = 10k: Manufacturer: YAGEO; Manufacturer Part Number: RC0603FR-0710KL; Procurement Status: Busca por MPN; SKU e disponibilidade a confirmar; BOM Purchase: Yes; Manufacturer 1: YAGEO; Manufacturer Part Number 1: RC0603FR-0710KL; Supplier 1: DigiKey; Supplier URL 1: https://www.digikey.com.br/pt/products/result?keywords=RC0603FR-0710KL; Supplier 2: Mouser; Supplier URL 2: https://br.mouser.com/c/?q=RC0603FR-0710KL; Datasheet: https://www.yageo.com/en/Product/Index/rchip
R1005 R1010 = 47k: Manufacturer: YAGEO; Manufacturer Part Number: RC0603FR-0747KL; Procurement Status: Busca por MPN; SKU e disponibilidade a confirmar; BOM Purchase: Yes; Manufacturer 1: YAGEO; Manufacturer Part Number 1: RC0603FR-0747KL; Supplier 1: DigiKey; Supplier URL 1: https://www.digikey.com.br/pt/products/result?keywords=RC0603FR-0747KL; Supplier 2: Mouser; Supplier URL 2: https://br.mouser.com/c/?q=RC0603FR-0747KL; Datasheet: https://www.yageo.com/en/Product/Index/rchip
R1006 = 56.0k: Manufacturer: YAGEO; Manufacturer Part Number: RT0603BRD0756KL; Review: Filme fino, 0,1%, 25 ppm/K; 0,1 W. Verificar dissipacao em R210/R212 e matching dos drivers.; Procurement Status: Busca por MPN; SKU e disponibilidade a confirmar; BOM Purchase: Yes; Manufacturer 1: YAGEO; Manufacturer Part Number 1: RT0603BRD0756KL; Supplier 1: DigiKey; Supplier URL 1: https://www.digikey.com.br/pt/products/result?keywords=RT0603BRD0756KL; Supplier 2: Mouser; Supplier URL 2: https://br.mouser.com/c/?q=RT0603BRD0756KL; Datasheet: https://www.yageo.com/en/Product/Index/rchip
R1007 R1009 = 10.0k: as R800 on sheet Bias_Q; Manufacturer 1: YAGEO; Manufacturer Part Number 1: RT0603BRD0710KL; Supplier 1: DigiKey; Supplier URL 1: https://www.digikey.com.br/pt/products/result?keywords=RT0603BRD0710KL; Supplier 2: Mouser; Supplier URL 2: https://br.mouser.com/c/?q=RT0603BRD0710KL; Datasheet: https://www.yageo.com/en/Product/Index/rchip
R1008 = 113k: Manufacturer: YAGEO; Manufacturer Part Number: RT0603BRD07113KL; Review: Filme fino, 0,1%, 25 ppm/K; 0,1 W. Verificar dissipacao em R210/R212 e matching dos drivers.; Procurement Status: Busca por MPN; SKU e disponibilidade a confirmar; BOM Purchase: Yes; Manufacturer 1: YAGEO; Manufacturer Part Number 1: RT0603BRD07113KL; Supplier 1: DigiKey; Supplier URL 1: https://www.digikey.com.br/pt/products/result?keywords=RT0603BRD07113KL; Supplier 2: Mouser; Supplier URL 2: https://br.mouser.com/c/?q=RT0603BRD07113KL; Datasheet: https://www.yageo.com/en/Product/Index/rchip
R1011 = 1k: Manufacturer: YAGEO; Manufacturer Part Number: RC0603FR-071KL; Procurement Status: Busca por MPN; SKU e disponibilidade a confirmar; BOM Purchase: Yes; Manufacturer 1: YAGEO; Manufacturer Part Number 1: RC0603FR-071KL; Supplier 1: DigiKey; Supplier URL 1: https://www.digikey.com.br/pt/products/result?keywords=RC0603FR-071KL; Supplier 2: Mouser; Supplier URL 2: https://br.mouser.com/c/?q=RC0603FR-071KL; Datasheet: https://www.yageo.com/en/Product/Index/rchip
SW1000 = ARM FISICO: Manufacturer: Wurth Elektronik; Manufacturer Part Number: 61300211121; Review: Header 1x2; shunt removivel listado como acessorio. SW1000 inicia aberto.; Procurement Status: Busca por MPN; SKU e disponibilidade a confirmar; BOM Purchase: Yes; Manufacturer 1: Wurth Elektronik; Manufacturer Part Number 1: 61300211121; Supplier 1: DigiKey; Supplier URL 1: https://www.digikey.com.br/pt/products/result?keywords=61300211121; Supplier 2: Mouser; Supplier URL 2: https://br.mouser.com/c/?q=61300211121; Datasheet: https://www.we-online.com/components/products/datasheet/61300211121.pdf
U1000 = CD74HCT123M96: Manufacturer: Texas Instruments; Procurement Status: Busca por MPN; SKU e disponibilidade a confirmar; BOM Purchase: Yes; Manufacturer Part Number: CD74HCT123M96; Manufacturer 1: Texas Instruments; Manufacturer Part Number 1: CD74HCT123M96; Supplier 1: DigiKey; Supplier URL 1: https://www.digikey.com.br/pt/products/result?keywords=CD74HCT123M96; Supplier 2: Mouser; Supplier URL 2: https://br.mouser.com/c/?q=CD74HCT123M96; Datasheet: https://www.ti.com/lit/ds/symlink/cd74hct123.pdf
U1001 = SN74LVC1G11DBVR: Manufacturer: Texas Instruments; Procurement Status: Busca por MPN; SKU e disponibilidade a confirmar; BOM Purchase: Yes; Manufacturer Part Number: SN74LVC1G11DBVR; Manufacturer 1: Texas Instruments; Manufacturer Part Number 1: SN74LVC1G11DBVR; Supplier 1: DigiKey; Supplier URL 1: https://www.digikey.com.br/pt/products/result?keywords=SN74LVC1G11DBVR; Supplier 2: Mouser; Supplier URL 2: https://br.mouser.com/c/?q=SN74LVC1G11DBVR; Datasheet: https://www.ti.com/lit/ds/symlink/sn74lvc1g11.pdf

## Sheet Notes.SchDoc: 15 - Dimensionamento, interfaces e pendencias
size A3; Project: CM5 Photonic Bias Controller; DocumentRev: R5; ProjectRev: R5; Version: Rev R6; SheetNumber: 16; SheetTotal: 17; Author: Carlos Renan; SCH_SCALE: N/A; Address1: UFCG; Address2: Referencia: VIRTUS CC; Address3: Campina Grande - PB; ProjectName: Controle automatico de BIAS para MZM/IQ - Projeto 3; DocumentName: Notes.SchDoc

### Notes on the sheet
- REVISION
- DESCRIPTION
- DATE
- APPROVED
- ADDRESS
- PROJECT
- VERSION
- TITLE
- A3
- SIZE
- SCALE
- DOCUMENT NAME:
- DOCUMENT REVISION:
- OF
- SHEET:
- PROJECT REVISION:

## Sheet Power_Neg15.SchDoc: Geracao interna de -15 V
size A3; Project: CM5 Photonic Bias Controller; DocumentRev: R5; ProjectRev: R5; Version: Rev R6; SheetNumber: 17; SheetTotal: 17; Author: Carlos Renan; SCH_SCALE: N/A; Address1: UFCG; Address2: Referencia: VIRTUS CC; Address3: Campina Grande - PB; ProjectName: Controle automatico de BIAS para MZM/IQ - Projeto 3; DocumentName: Power_Neg15.SchDoc
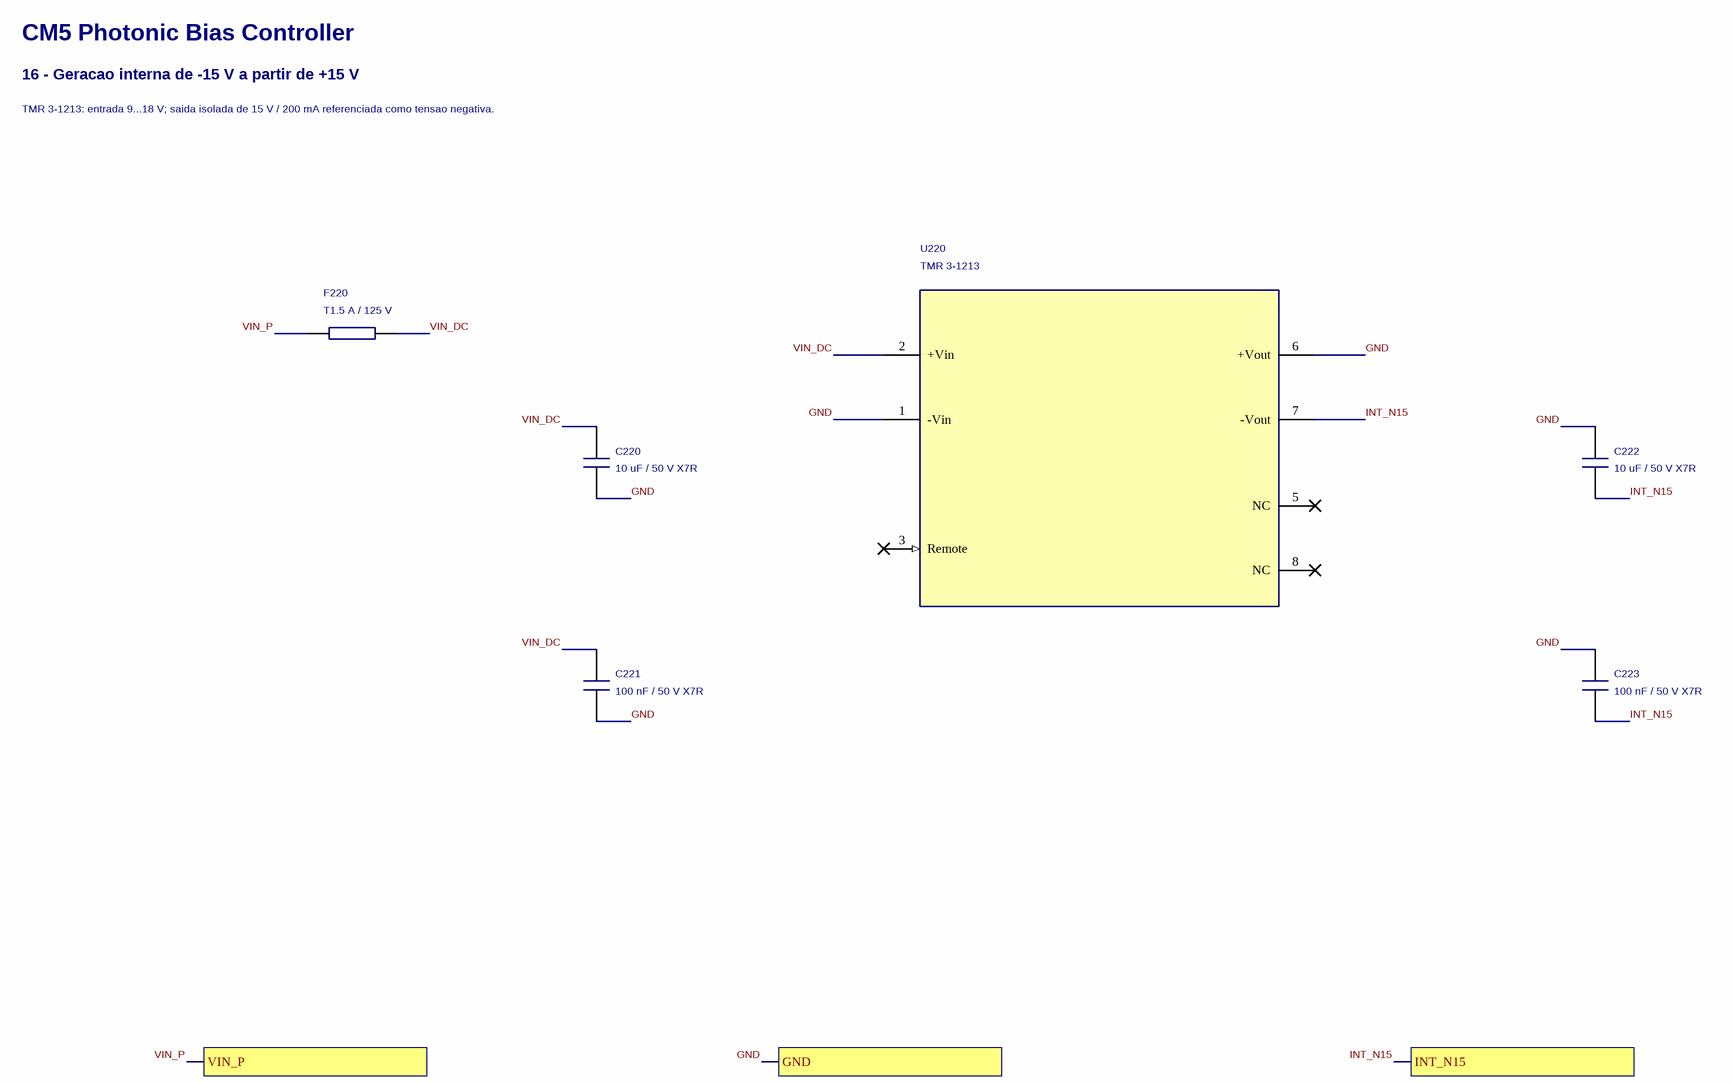
[diagram p18: Power_Neg15.SchDoc]

### Parts
C220  10 uF / 50 V X7R  [C1210]
C221  100 nF / 50 V X7R  [C0805]
C222  10 uF / 50 V X7R  [C1210]
C223  100 nF / 50 V X7R  [C0805]
F220  T1.5 A / 125 V  [FUSE_NANO2]
U220  TMR 3-1213  [TMR3_SIP8_15V]

### Ports
GND, INT_N15, VIN_P

### Nets
GND: C220.2 C221.2 C222.1 C223.1 U220.1(-Vin) U220.6(+Vout) ; port GND
INT_N15: C222.2 C223.2 U220.7(-Vout) ; port INT_N15
VIN_DC: C220.1 C221.1 F220.2 U220.2(+Vin)
VIN_P: F220.1 ; port VIN_P

Not connected (* = marked no-connect by the designer): U220 3(Remote)* 5(NC)* 8(NC)*

### Notes on the sheet
- CM5 Photonic Bias Controller
- 16 - Geracao interna de -15 V a partir de +15 V
- TMR 3-1213: entrada 9...18 V; saida isolada de 15 V / 200 mA referenciada como tensao negativa.
- REVISION
- DESCRIPTION
- DATE
- APPROVED
- ADDRESS
- PROJECT
- VERSION
- TITLE
- A3
- SIZE
- SCALE
- DOCUMENT NAME:
- DOCUMENT REVISION:
- OF
- SHEET:
- PROJECT REVISION:

### Library data of the parts
C220 C222 = 10uF_50V: Manufacturer: KEMET; Manufacturer Part Number: C1210C106K5RACTU; Review: Desacoplamento local do conversor; capacitor ceramico nao polarizado.; Procurement Status: Busca por MPN; SKU e disponibilidade a confirmar; BOM Purchase: Yes; Manufacturer 1: KEMET; Manufacturer Part Number 1: C1210C106K5RACTU; Supplier 1: DigiKey; Supplier URL 1: https://www.digikey.com.br/pt/products/result?keywords=C1210C106K5RACTU; Supplier 2: Mouser; Supplier URL 2: https://br.mouser.com/c/?q=C1210C106K5RACTU; Datasheet: https://www.yageogroup.com/download/specsheet/C1210C106K5RACTU
C221 C223 = 100nF_50V: Manufacturer: KEMET; Manufacturer Part Number: C0805C104K5RACTU; Procurement Status: Busca por MPN; SKU e disponibilidade a confirmar; BOM Purchase: Yes; Manufacturer 1: KEMET; Manufacturer Part Number 1: C0805C104K5RACTU; Supplier 1: DigiKey; Supplier URL 1: https://www.digikey.com.br/pt/products/result?keywords=C0805C104K5RACTU; Supplier 2: Mouser; Supplier URL 2: https://br.mouser.com/c/?q=C0805C104K5RACTU; Datasheet: https://www.yageogroup.com/download/specsheet/C0805C104K5RACTU
F220 = T1.5A: Manufacturer: Littelfuse; Manufacturer Part Number: 045201.5MRL; Review: F220: 1,5 A retardado, Littelfuse 045201.5MRL. TRACO recomenda 1,6 A retardado; validar corrente de partida, I2t e coordenacao de protecao.; Procurement Status: MPN selecionado; SKU e disponibilidade a confirmar; BOM Purchase: Yes; Manufacturer 1: Littelfuse; Manufacturer Part Number 1: 045201.5MRL; Supplier 1: DigiKey; Supplier URL 1: https://www.digikey.com/en/products/result?keywords=045201.5MRL; Supplier 2: Mouser; Supplier URL 2: https://www.mouser.com/c/?q=045201.5MRL; Datasheet: https://www.mouser.com/datasheet/2/240/Littelfuse_452_454-58610.pdf
U220 = TMR 3-1213: DC/DC 3 W: +15 V para -15 V / 200 mA; Manufacturer: TRACO Power; Procurement Status: Busca por MPN; SKU e disponibilidade a confirmar; BOM Purchase: Yes; Manufacturer Part Number: TMR 3-1213; Manufacturer 1: TRACO Power; Manufacturer Part Number 1: TMR 3-1213; Supplier 1: DigiKey; Supplier URL 1: https://www.digikey.com/en/products/result?keywords=TMR%203-1213; Supplier 2: Mouser; Supplier URL 2: https://www.mouser.com/c/?q=TMR%203-1213; Datasheet: https://www.tracopower.com/products/tmr3.pdf

## Nets that join several sheets
+11VA: Power_Analog (7 pins), Bias_I (C701.1 U700.7), Bias_Q (C801.1 U800.7), Bias_PHI (C901.1 U900.7), Safety_Watchdog (R1006.1)
AVDD5: Power_Analog (C215.1 C216.2 U212.1 U212.2), ADC (5 pins), TIA (6 pins), DAC_Reference (5 pins), Safety_Window (C1100.1 U1100.7)
GND: Power_Input_5V (16 pins), Power_Analog (11 pins), CM5_GPIO (25 pins), CM5_HighSpeed (30 pins), CM5_Boot_USB (16 pins), MCU_RP2040 (15 pins), ADC (13 pins), TIA (11 pins), DAC_Reference (10 pins), Bias_I (7 pins), Bias_Q (7 pins), Bias_PHI (7 pins), Safety_Window (12 pins), Safety_Watchdog (13 pins), Power_Neg15 (6 pins)
+5V_SYS: Power_Input_5V (5 pins), CM5_GPIO (10 pins), CM5_Boot_USB (J104.2), MCU_RP2040 (D300.2), Safety_Window (U1101.3 U1102.3), Safety_Watchdog (7 pins)
-11VA: Power_Analog (C213.2 D211.1 R212.1 U211.3), Bias_I (C702.1 U700.4), Bias_Q (C802.1 U800.4), Bias_PHI (C902.1 U900.4), Safety_Watchdog (R1008.1)
ADC_CS_N: MCU_RP2040 (U300.22), ADC (R401.2 U400.20)
ADC_DRDY_N: MCU_RP2040 (U300.29), ADC (U400.21)
ADC_RESET_N: MCU_RP2040 (U300.4), ADC (R402.2 U400.15)
ADC_SYNC_N: MCU_RP2040 (U300.5), ADC (R403.2 U400.14)
ARM_REQUEST: MCU_RP2040 (U300.10), Safety_Watchdog (R1011.2)
BIAS_F_I: Bias_I (C700.1 K700.4 R704.2 TP700.1), Safety_Window (R1110.1)
BIAS_F_PHI: Bias_PHI (C900.1 K900.4 R904.2 TP900.1), Safety_Window (R1118.1)
BIAS_F_Q: Bias_Q (C800.1 K800.4 R804.2 TP800.1), Safety_Window (R1114.1)
CM5_3V3: CM5_GPIO (J100.78 J100.84 J100.86), CM5_Boot_USB (C100.1 J103.1 U101.5), MCU_RP2040 (C301.1 U301.5)
CM5_ACT_N: CM5_GPIO (J100.21), CM5_HighSpeed (TP100.1)
CM5_ARM_REQ: CM5_GPIO (J100.50), Safety_Watchdog (R1010.1 R1011.1)
CM5_BOOT_N: CM5_GPIO (J100.93), CM5_Boot_USB (JP100.1)
CM5_FAN_PWM: CM5_GPIO (J100.19), CM5_Boot_USB (J104.4)
CM5_FAN_TACH: CM5_GPIO (J100.16), CM5_Boot_USB (J104.3)
CM5_HEARTBEAT: CM5_GPIO (J100.54), Safety_Watchdog (R1005.1 U1000.10)
CM5_PMIC_EN: CM5_GPIO (J100.99), CM5_Boot_USB (JP101.1)
CM5_PWR_BUTTON: CM5_GPIO (J100.92), CM5_Boot_USB (SW100.1)
CM5_SCL: CM5_GPIO (J100.56), CM5_Boot_USB (J103.4)
CM5_SDA: CM5_GPIO (J100.58), CM5_Boot_USB (J103.3)
CM5_UART_RX: CM5_GPIO (J100.51), MCU_RP2040 (U301.4)
CM5_UART_TX: CM5_GPIO (J100.55), MCU_RP2040 (U302.2)
CM5_USB_N: CM5_HighSpeed (J101.3), CM5_Boot_USB (U100.6)
CM5_USB_P: CM5_HighSpeed (J101.5), CM5_Boot_USB (U100.4)
COIL_5V: Bias_I (D700.1 K700.1), Bias_Q (D800.1 K800.1), Bias_PHI (D900.1 K900.1), Safety_Watchdog (SW1000.2)
COIL_RETURN: Bias_I (D700.2 K700.8), Bias_Q (D800.2 K800.8), Bias_PHI (D900.2 K900.8), Safety_Watchdog (Q1000.3)
DAC_CS_N: MCU_RP2040 (U300.26), DAC_Reference (R600.2 U600.12)
DAC_I: DAC_Reference (U600.2), Bias_I (R702.1)
DAC_LDAC_N: MCU_RP2040 (U300.27), DAC_Reference (R601.2 U600.11)
DAC_PHI: DAC_Reference (U600.4), Bias_PHI (R902.1)
DAC_Q: DAC_Reference (U600.3), Bias_Q (R802.1)
FAULT_N: MCU_RP2040 (U300.9), Safety_Window (8 pins), Safety_Watchdog (R1004.2 U1001.6)
INT_N15: Power_Input_5V (F201.1), Power_Neg15 (C222.2 C223.2 U220.7)
MCU_3V3: MCU_RP2040 (C302.1 U300.36 U302.5), ADC (5 pins), DAC_Reference (7 pins), Safety_Watchdog (C1005.1 R1004.1 U1001.5)
MCU_ARM: MCU_RP2040 (R302.1 U300.6), Safety_Watchdog (U1000.3 U1000.11)
MCU_HEARTBEAT: MCU_RP2040 (U300.7), Safety_Watchdog (U1000.2)
MON_I: ADC (U400.7), Safety_Window (6 pins)
MON_PHI: ADC (U400.9), Safety_Window (6 pins)
MON_Q: ADC (U400.8), Safety_Window (6 pins)
PHOTO_ADC: ADC (U400.6), TIA (C507.1 R505.2 TP501.1)
RAIL_NEG: Safety_Window (U1102.10), Safety_Watchdog (R1008.2 R1009.2)
RAIL_POS: Safety_Window (U1102.9), Safety_Watchdog (R1006.2 R1007.1)
REF_ADC: ADC (C400.1 C401.1 R400.2 U400.4), TIA (R501.1), Safety_Window (U1100.3)
REF_BUF: Safety_Window (7 pins), Safety_Watchdog (R1009.1)
SPI_MISO: MCU_RP2040 (U300.21), ADC (U400.22), DAC_Reference (U600.15)
SPI_MOSI: MCU_RP2040 (R301.2), ADC (U400.23), DAC_Reference (U600.14)
SPI_SCLK: MCU_RP2040 (R300.2), ADC (U400.24), DAC_Reference (U600.13)
USB_VBUS_OK: CM5_GPIO (J100.24), CM5_Boot_USB (U101.4)
VIN_N: Power_Input_5V (D202.2 D203.2), Power_Analog (C212.1 D211.2 U211.2)
VIN_P: Power_Input_5V (8 pins), Power_Analog (C210.1 D210.1 U210.3), Power_Neg15 (F220.1)
VMID_DAC: DAC_Reference (TP601.1 U601.2 U601.6), Bias_I (R700.1), Bias_Q (R800.1), Bias_PHI (R900.1)